# Altium project MVP-Dash-v1.0.PrjPcb (part 5 of 15)

## Sheet RK3568-Flash-SD-Controller.SchDoc
size 420 x 297 mm; SheetNumber: 7; SheetTotal: 25
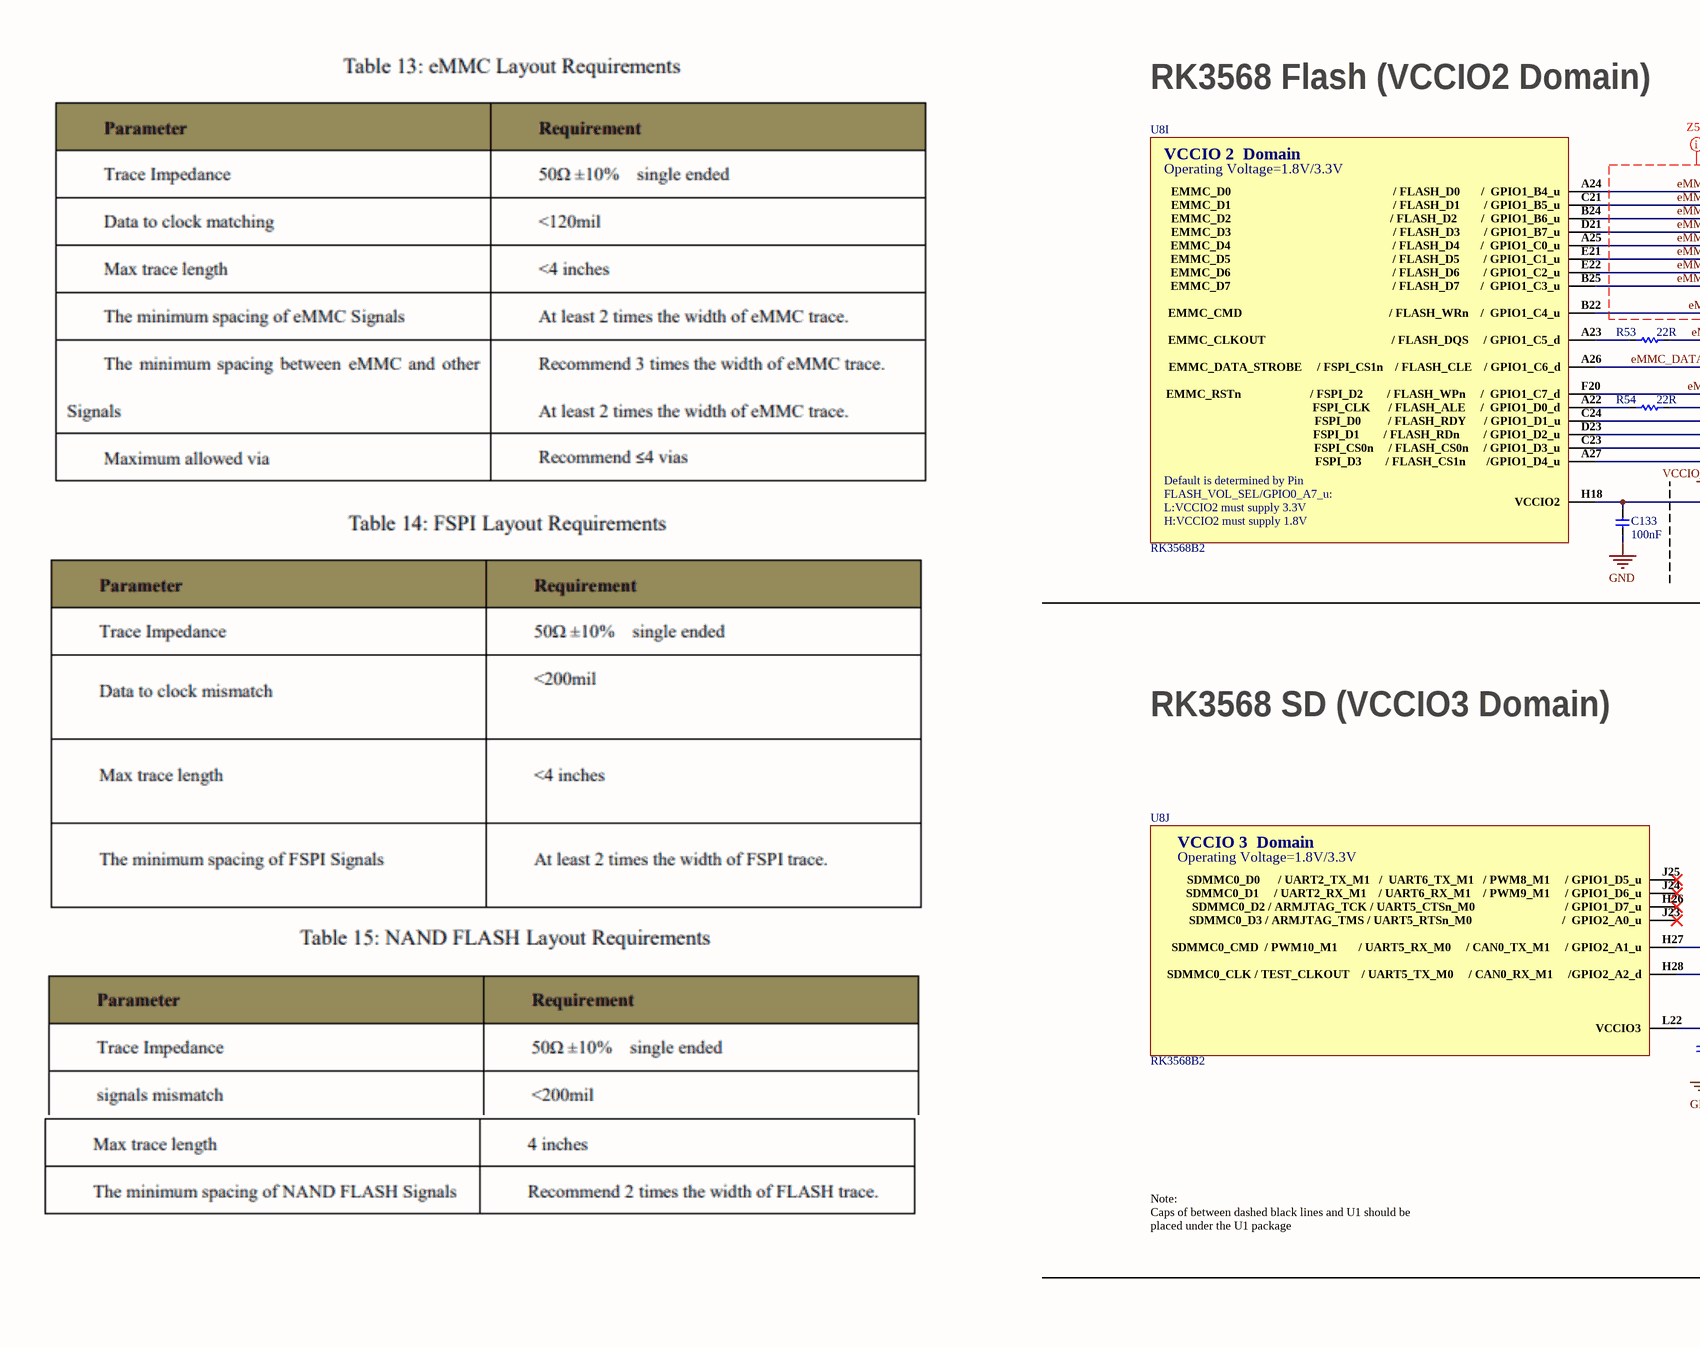
[diagram p8: RK3568-Flash-SD-Controller.SchDoc, left]
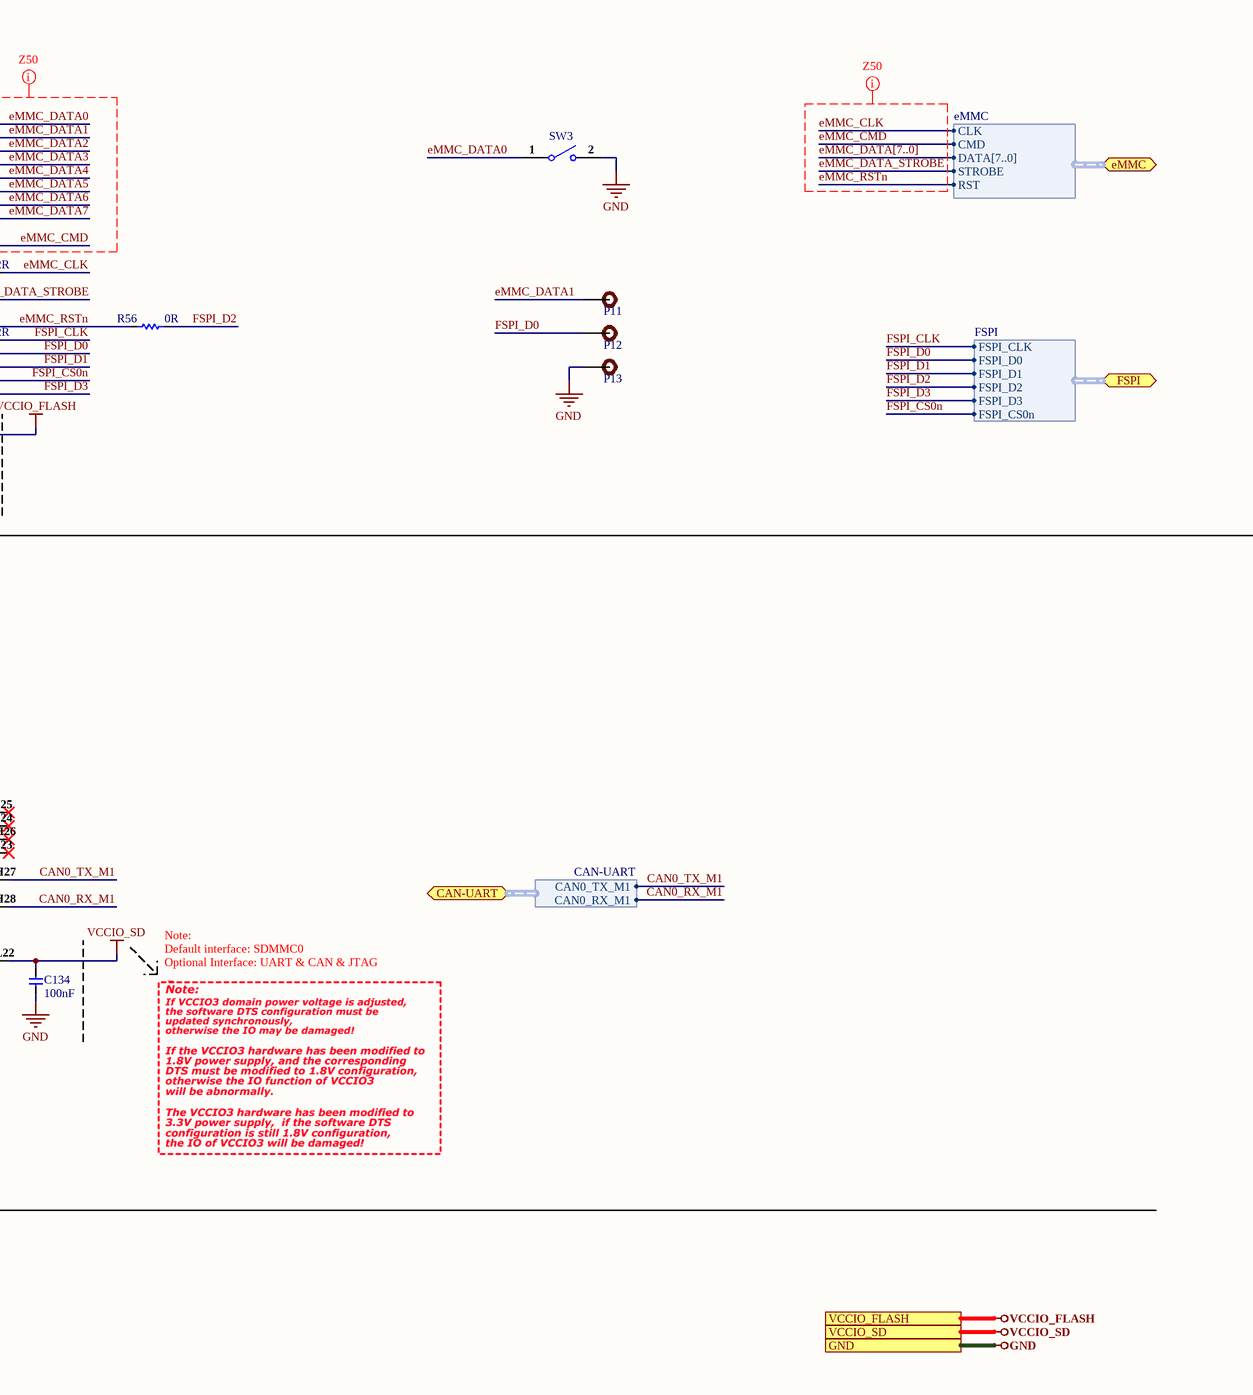
[diagram p9: RK3568-Flash-SD-Controller.SchDoc, right]

### Parts
C133  100nF  [CAP-0201]
C134  100nF  [CAP-0201]
P11  TEST POINT 0.5mm Dia  [Test-point - 0.5mm]  (value not drawn)  (no BOM)
P12  TEST POINT 0.5mm Dia  [Test-point - 0.5mm]  (value not drawn)  (no BOM)
P13  TEST POINT 0.5mm Dia  [Test-point - 0.5mm]  (value not drawn)  (no BOM)
R53  22R  [Res-0402]
R54  22R  [Res-0402]
R56  0R  [Res-0402]
SW3  B3U-1000P  [B3U-1000P]  (value not drawn)
U8  RK3568B2  [FCCSP-636L]  (parts I,J of 23)

### Ports
CAN-UART (bidir, harness CAN-UART, see CAN-Bus-SPI-Flash-Sheet[1D]), eMMC (bidir, harness eMMC, see eMMC-Sheet[2D]), FSPI (bidir, harness FSPI, see CAN-Bus-SPI-Flash-Sheet[3D]), GND (see CAN-Bus-SPI-Flash-Sheet[4D], Connector-Sheet[5D], DRAM-LPDDR4x-Sheet[4D], eMMC-Sheet[4D], LED-Debug-Sheet[4D], Power-DC-IN-Sheet[4D], Power-Others-Sheet[4D], Power-PMIC-Sheet[4D], RK3568-Audio-Interface[4D], RK3568-OSC-PMUIO-Sheet[5D], RK3568-Power-Sheet[4D], RK3568-SARADC-GPIO[4D], RK3568-USB-PCIe-Sheet[5D], RK3568-VI-Interface-Sheet[4D], RK3568-VO-Interface-1[4D], RK3568-VO-Interface-2[4D], Sensors-Sheet-1[4D], Sensors-Sheet-2[5D], Type-C-Sheet[4D], USB-Ports[4D], VO-HDMI2.0-TX-Sheet[4D], VO-LCM-MIPI-DSI-TX0[4D], WIFI-BT-SDIO-Sheet[4D]), VCCIO_FLASH (see CAN-Bus-SPI-Flash-Sheet[4D], eMMC-Sheet[4D], Power-Others-Sheet[4D]), VCCIO_SD (see Power-PMIC-Sheet[3D])

### Harnesses
eMMC: DATA[7..0], STROBE, CLK, CMD, RST
FSPI: FSPI_D2, FSPI_CLK, FSPI_D0, FSPI_D1, FSPI_CS0n, FSPI_D3
CAN-UART: CAN0_TX_M1, CAN0_RX_M1

### Nets
GND: C133.1 C134.1 P13.1 SW3.2 ; port GND
VCCIO_FLASH: C133.2 U8.H18(VCCIO2) ; port VCCIO_FLASH
VCCIO_SD: C134.2 U8.L22(VCCIO3) ; port VCCIO_SD
CAN0_RX_M1: U8.H28(SDMMC0_CLK_/_TEST_CLKOUT____/_UART5_TX_M0_____/_CAN0_RX_M1_____/GPIO2_A2_d) ; port CAN-UART.CAN0_RX_M1
CAN0_TX_M1: U8.H27(SDMMC0_CMD__/_PWM10_M1_______/_UART5_RX_M0_____/_CAN0_TX_M1_____/_GPIO2_A1_u) ; port CAN-UART.CAN0_TX_M1
eMMC_CLK: R53.1 ; port eMMC.CLK
eMMC_CMD: U8.B22(EMMC_CMD_________________________________________________/_FLASH_WRn____/__GPIO1_C4_u) ; port eMMC.CMD
eMMC_DATA0: SW3.1 U8.A24(EMMC_D0______________________________________________________/_FLASH_D0_______/__GPIO1_B4_u)
eMMC_DATA1: P11.1 U8.C21(EMMC_D1______________________________________________________/_FLASH_D1________/_GPIO1_B5_u)
eMMC_DATA2: U8.B24(EMMC_D2_____________________________________________________/_FLASH_D2________/__GPIO1_B6_u)
eMMC_DATA3: U8.D21(EMMC_D3______________________________________________________/_FLASH_D3________/_GPIO1_B7_u)
eMMC_DATA4: U8.A25(EMMC_D4______________________________________________________/_FLASH_D4_______/__GPIO1_C0_u)
eMMC_DATA5: U8.E21(EMMC_D5______________________________________________________/_FLASH_D5________/_GPIO1_C1_u)
eMMC_DATA6: U8.E22(EMMC_D6______________________________________________________/_FLASH_D6________/_GPIO1_C2_u)
eMMC_DATA7: U8.B25(EMMC_D7______________________________________________________/_FLASH_D7_______/__GPIO1_C3_u)
eMMC_DATA_STROBE: U8.A26(EMMC_DATA_STROBE_____/_FSPI_CS1n____/_FLASH_CLE____/_GPIO1_C6_d) ; port eMMC.STROBE
eMMC_RSTn: R56.1 U8.F20(EMMC_RSTn_______________________/_FSPI_D2________/_FLASH_WPn_____/__GPIO1_C7_d) ; port eMMC.RST
FSPI_CLK: R54.1 ; port FSPI.FSPI_CLK
FSPI_CS0n: U8.C23(FSPI_CS0n_____/_FLASH_CS0n_____/_GPIO1_D3_u) ; port FSPI.FSPI_CS0n
FSPI_D0: P12.1 U8.C24(FSPI_D0_________/_FLASH_RDY______/_GPIO1_D1_u) ; port FSPI.FSPI_D0
FSPI_D1: U8.D23(FSPI_D1________/_FLASH_RDn________/_GPIO1_D2_u) ; port FSPI.FSPI_D1
FSPI_D2: R56.2 ; port FSPI.FSPI_D2
FSPI_D3: U8.A27(FSPI_D3________/_FLASH_CS1n_______/GPIO1_D4_u) ; port FSPI.FSPI_D3
NetR53_2: R53.2 U8.A23(EMMC_CLKOUT__________________________________________/_FLASH_DQS_____/_GPIO1_C5_d)
NetR54_2: R54.2 U8.A22(FSPI_CLK______/_FLASH_ALE_____/__GPIO1_D0_d)

Not connected (* = marked no-connect by the designer): U8 H26(SDMMC0_D2_/_ARMJTAG_TCK_/_UART5_CTSn_M0______________________________/_GPIO1_D7_u)* J23(SDMMC0_D3_/_ARMJTAG_TMS_/_UART5_RTSn_M0______________________________/__GPIO2_A0_u)* J24(SDMMC0_D1_____/_UART2_RX_M1____/_UART6_RX_M1____/_PWM9_M1_____/_GPIO1_D6_u)* J25(SDMMC0_D0______/_UART2_TX_M1___/__UART6_TX_M1___/_PWM8_M1_____/_GPIO1_D5_u)*

### Buses and harness runs
bus eMMC_DATA[7..0]

### Layout directives
net class 50OHM_DDR: eMMC_CLK, eMMC_CMD, eMMC_DATA0, eMMC_DATA1, eMMC_DATA2, eMMC_DATA3, eMMC_DATA4, eMMC_DATA5, eMMC_DATA6, eMMC_DATA7, eMMC_DATA[7..0], eMMC_DATA_STROBE, eMMC_RSTn

### Notes on the sheet
- RK3568 Flash (VCCIO2 Domain)
- RK3568 SD (VCCIO3 Domain)
- Note:
  Default interface: SDMMC0
  Optional Interface: UART & CAN & JTAG
- Note:
  Caps of between dashed black lines and U1 should be placed under the U1 package
- File:
- Title:
- Date:
- Page
- Num:
- Total:
- Drawn By: Huzaifa Ali
- (in symbol RK3568B2, part I) VCCIO 2  Domain; Operating Voltage=1.8V/3.3V; Default is determined by Pin; FLASH_VOL_SEL/GPIO0_A7_u:; L:VCCIO2 must supply 3.3V; H:VCCIO2 must supply 1.8V
- (in symbol RK3568B2, part J) VCCIO 3  Domain; Operating Voltage=1.8V/3.3V

### Library data of the parts
C133 C134 = CC0201KRX5R6BB104: as C124-C131 on sheet RK3568-OSC-PMUIO-Sheet; Supplier 1: Mouser; Manufacturer Part Number: CC0201KRX5R6BB104; RoHS: Yes; Category: Ceramic Capacitors; Stock 1: 824403; Pricing 1: 1=0.10000, 10=0.02400, 50=0.02400, 100=0.01900, 1000=0.01100, 10000=0.00900 (USD); Mount: Surface Mount; Case/Package: 0201; Case Code (Imperial): 0201; Case Code (Metric): 0603; Weight: 6E-06oz; Min Operating Temperature: -55°C; Max Operating Temperature: 85°C; Capacitance: 100nF; Dielectric: X5R; Voltage Rating (DC): 10V; Packaging: Tape and Reel; Termination: SMD/SMT; Resistor Type: Ceramic; Voltage Rating: 10V; Series: CC; Construction: Flat; Length: 0.6mm; Width: 0.012inch; Height: 0.3mm; Thickness: 0.013inch; Depth: 0.3mm; Radiation Hardening: No; Lead Free: Lead Free; Halogen Free: Halogen Free; RoHS Compliant: Yes; ComponentLink1URL: https://datasheet.ciiva.com/11587/upy-gphc-x5r-4v-to-50v-12-11587190.pdf?src-supplier=Avnet; ComponentLink1Description: https://datasheet.ciiva.com/11587/upy-gphc-x5r-4v-to-50v-12-11587190.pdf?src-supplier=Avnet; Supplier Part Number 1: 603-CC201KRX5R6BB104; LCSC Part Number: C190183
P11-P13 = TEST POINT 0.5mm Dia: Test Point ON; Item Type: Test Point; Manufacturer Part Number: TEST POINT 0.5mm Dia
R53 R54 = RC0402FR-0722RL: RES 22 OHM 1% 1/16W 0402; Manufacturer: Yageo; Voltage Rating: 50V; Power Rating: 62.5mW; Temperature Coefficient: 100ppm/°C; Max Power Dissipation: 63mW; Item Type: Resistor; Supplier 1: Avnet; Manufacturer Part Number: RC0402FR-0722RL; RoHS: Yes; Category: Chip SMD Resistors; Stock 1: 1810000; Pricing 1: 10000=0.00085 (USD); Case/Package: 0402; Number of Pins: 2; Case Code (Imperial): 0402; Case Code (Metric): 1005; Size Code: 0402; Min Operating Temperature: -55°C; Max Operating Temperature: 155°C; Resistor Type: Thick Film; Voltage Rating (DC): 50V; Resistance: 22R; Tolerance: 1%; Packaging: Tape and Reel; Termination: SMD/SMT; Features: Moisture Resistant; Series: RC; Number of Terminations: 2; Resistance Tolerance: 1%; Technology: THICK FILM; Construction: Rectangular; Length: 1mm; Width: 0.5mm; Height: 0.32mm; Depth: 0.5mm; RoHS Compliant: Yes; Reach SVHC Compliant: Yes; Military Standard: Not; Lead Free: Lead Free; ComponentLink1URL: https://datasheet.ciiva.com/11819/0900766b80c66297-11819462.pdf?src-supplier=RSComponents; ComponentLink1Description: https://datasheet.ciiva.com/11819/0900766b80c66297-11819462.pdf?src-supplier=RSComponents; ComponentLink2URL: https://datasheet.ciiva.com/7849/1018594-7849912.pdf?src-supplier=Element14; ComponentLink2Description: https://datasheet.ciiva.com/7849/1018594-7849912.pdf?src-supplier=Element14; ComponentLink3URL: https://datasheet.ciiva.com/7849/1018594-7849911.pdf?src-supplier=Element14; ComponentLink3Description: https://datasheet.ciiva.com/7849/1018594-7849911.pdf?src-supplier=Element14; ComponentLink4URL: https://datasheet.ciiva.com/16930/pyu-rc0402-51-rohs-l-6-r-16930687.pdf?src-supplier=Future+Electronics; ComponentLink4Description: https://datasheet.ciiva.com/16930/pyu-rc0402-51-rohs-l-6-r-16930687.pdf?src-supplier=Future+Electronics; ComponentLink5URL: https://datasheet.ciiva.com/26829/getdatasheetpartid-554995-26829991.pdf?src-supplier=Verical; ComponentLink5Description: https://datasheet.ciiva.com/26829/getdatasheetpartid-554995-26829991.pdf?src-supplier=Verical; Supplier Part Number 1: RC0402FR-0722RL; LCSC Part Number: C114765
R56 = RC0402FR-070RL: RES 0 OHM JUMPER 1/16W 0402; Manufacturer: Yageo; Tolerance: 1%; Power Rating: 62.5mW; Voltage Rating: 50V; Temperature Coefficient: 200ppm/°C; Max Power Dissipation: 63mW; Supplier 1: Mouser; Manufacturer Part Number: RC0402FR-070RL; RoHS: Yes; Category: Chip SMD Resistors; Stock 1: 8556842; Pricing 1: 1=0.10000, 10=0.01400, 50=0.01400, 100=0.00600, 1000=0.00300, 5000=0.00200, 10000=0.00100 (USD); Mount: Surface Mount; Case/Package: 0402; Contact Plating: Tin,Matte; Case Code (Imperial): 0402; Case Code (Metric): 1005; Size Code: 0402; Min Operating Temperature: -55°C; Max Operating Temperature: 155°C; Resistance: 0R; Resistor Type: Thick Film; Packaging: Tape and Reel; Termination: SMD/SMT; Features: Moisture Resistant; Series: RC; Number of Terminations: 2; Length: 1mm; Width: 0.5mm; Height: 0.35mm; Radiation Hardening: No; Lead Free: Lead Free; RoHS Compliant: Yes; ComponentLink1URL: https://datasheet.ciiva.com/8896/pyu-rc0402-51-rohs-l-6-8896149.pdf?src-supplier=Avnet; ComponentLink1Description: https://datasheet.ciiva.com/8896/pyu-rc0402-51-rohs-l-6-8896149.pdf?src-supplier=Avnet; ComponentLink2URL: https://datasheet.ciiva.com/16790/pyu-rc0402-51-rohs-l-6-r-16790444.pdf?src-supplier=Future+Electronics; ComponentLink2Description: https://datasheet.ciiva.com/16790/pyu-rc0402-51-rohs-l-6-r-16790444.pdf?src-supplier=Future+Electronics; Supplier Part Number 1: 603-RC0402FR-070RL; LCSC Part Number: C106231
SW3 = B3U-1000P: SWITCH TACTILE SPST-NO 0.05A 12V; Manufacturer: Omron; Mechanical Life: 200000Cycles; Operating Force: 1.5N; Throw Configuration: SPST; Current Rating: 50mA; Contact Resistance: 100mR; Illumination Type: Non-Illuminated,Illuminated; Switch Travel: 0.15mm; Switch Function: Off-Mom; Actuator Type: Standard; Actuator Length: 0.4mm; Ratings: Dust Proof,IP40; ComponentLink1URL: http://www.farnell.com/datasheets/60838.pdf?src-supplier=Farnell; ComponentLink1Description: http://www.farnell.com/datasheets/60838.pdf?src-supplier=Farnell; ComponentLink2URL: http://www.farnell.com/datasheets/60838.pdf?src-supplier=Element14; ComponentLink2Description: http://www.farnell.com/datasheets/60838.pdf?src-supplier=Element14; ComponentLink3URL: https://omronfs.omron.com/en_US/ecb/products/pdf/en-b3u.pdf?src-supplier=Digi-Key; ComponentLink3Description: https://omronfs.omron.com/en_US/ecb/products/pdf/en-b3u.pdf?src-supplier=Digi-Key; ComponentLink4URL: http://www.omron.com/ecb/products/pdf/en-b3u.pdf?src-supplier=Digi-Key; ComponentLink4Description: http://www.omron.com/ecb/products/pdf/en-b3u.pdf?src-supplier=Digi-Key; ComponentLink5URL: https://www.distrelec.biz/Web/Downloads/he/et/B3U_eng_datasheet.pdf?mime=application%2Fpdf&src-supplier=Distrelec; ComponentLink5Description: https://www.distrelec.biz/Web/Downloads/he/et/B3U_eng_datasheet.pdf?mime=application%2Fpdf&src-supplier=Distrelec; ComponentLink6URL: http://www.onlinecomponents.com/productFiles/mf-OM/en-b3u.pdf?src-supplier=Onlinecomponents.com; ComponentLink6Description: http://www.onlinecomponents.com/productFiles/mf-OM/en-b3u.pdf?src-supplier=Onlinecomponents.com; Supplier 1: Digi-Key; Manufacturer Part Number: B3U-1000P; Stock 1: 116454; Pricing 1: 1=1, 10=0.961, 25=0.9064, 50=0.7976, 100=0.7251, 250=0.68888, 500=0.67074, 1000=0.52571 (USD); Mount: Surface Mount; Weight: 0.000776oz; Contact Material: Silver; Min Operating Temperature: -25°C; Max Operating Temperature: 70°C; Packaging: Tape and Reel; Voltage Rating (DC): 12V; Package Quantity: 1; Max Current Rating: 50mA; Termination: SMD/SMT; Orientation: Straight; Max Voltage Rating (DC): 12V; Electrical Life: 200000Cycles; Insulation Resistance: 100MR; Contact Current Rating: 50mA; Length: 4mm; Height: 1.2mm; Depth: 2.5mm; Width: 3mm; REACH SVHC: Unknown; Lead Free: Lead Free; ComponentLink7URL: https://www.verical.com/server-webapp/html/getDatasheet?partID=552554&src-supplier=Verical; ComponentLink7Description: https://www.verical.com/server-webapp/html/getDatasheet?partID=552554&src-supplier=Verical; ComponentLink8URL: http://www.farnell.com/datasheets/1685550.pdf?src-supplier=Element14; ComponentLink8Description: http://www.farnell.com/datasheets/1685550.pdf?src-supplier=Element14; ComponentLink9URL: http://www.farnell.com/datasheets/2610940.pdf?src-supplier=Farnell; ComponentLink9Description: http://www.farnell.com/datasheets/2610940.pdf?src-supplier=Farnell; ComponentLink10URL: https://www.alliedelec.com/m/d/4c8a9ef82804fc3c241a13c1e298fd73.pdf?src-supplier=Allied+Electronics; ComponentLink10Description: https://www.alliedelec.com/m/d/4c8a9ef82804fc3c241a13c1e298fd73.pdf?src-supplier=Allied+Electronics; Supplier Part Number 1: SW1020DKR-ND; LCSC Part Number: C231329; Item Type: Switch
U8 = RK3568B2: FCCSP-636L Microcontroller Units (MCUs/MPUs/SOCs) ROHS; Manufacturer: Rockchip; Item Type: IC; Manufacturer Part Number: RK3568B2; Package: FCCSP-636L; LCSC Part Number: C3345225

## Sheet RK3568-USB-PCIe-Sheet.SchDoc
size 420 x 297 mm; SheetNumber: 8; SheetTotal: 25
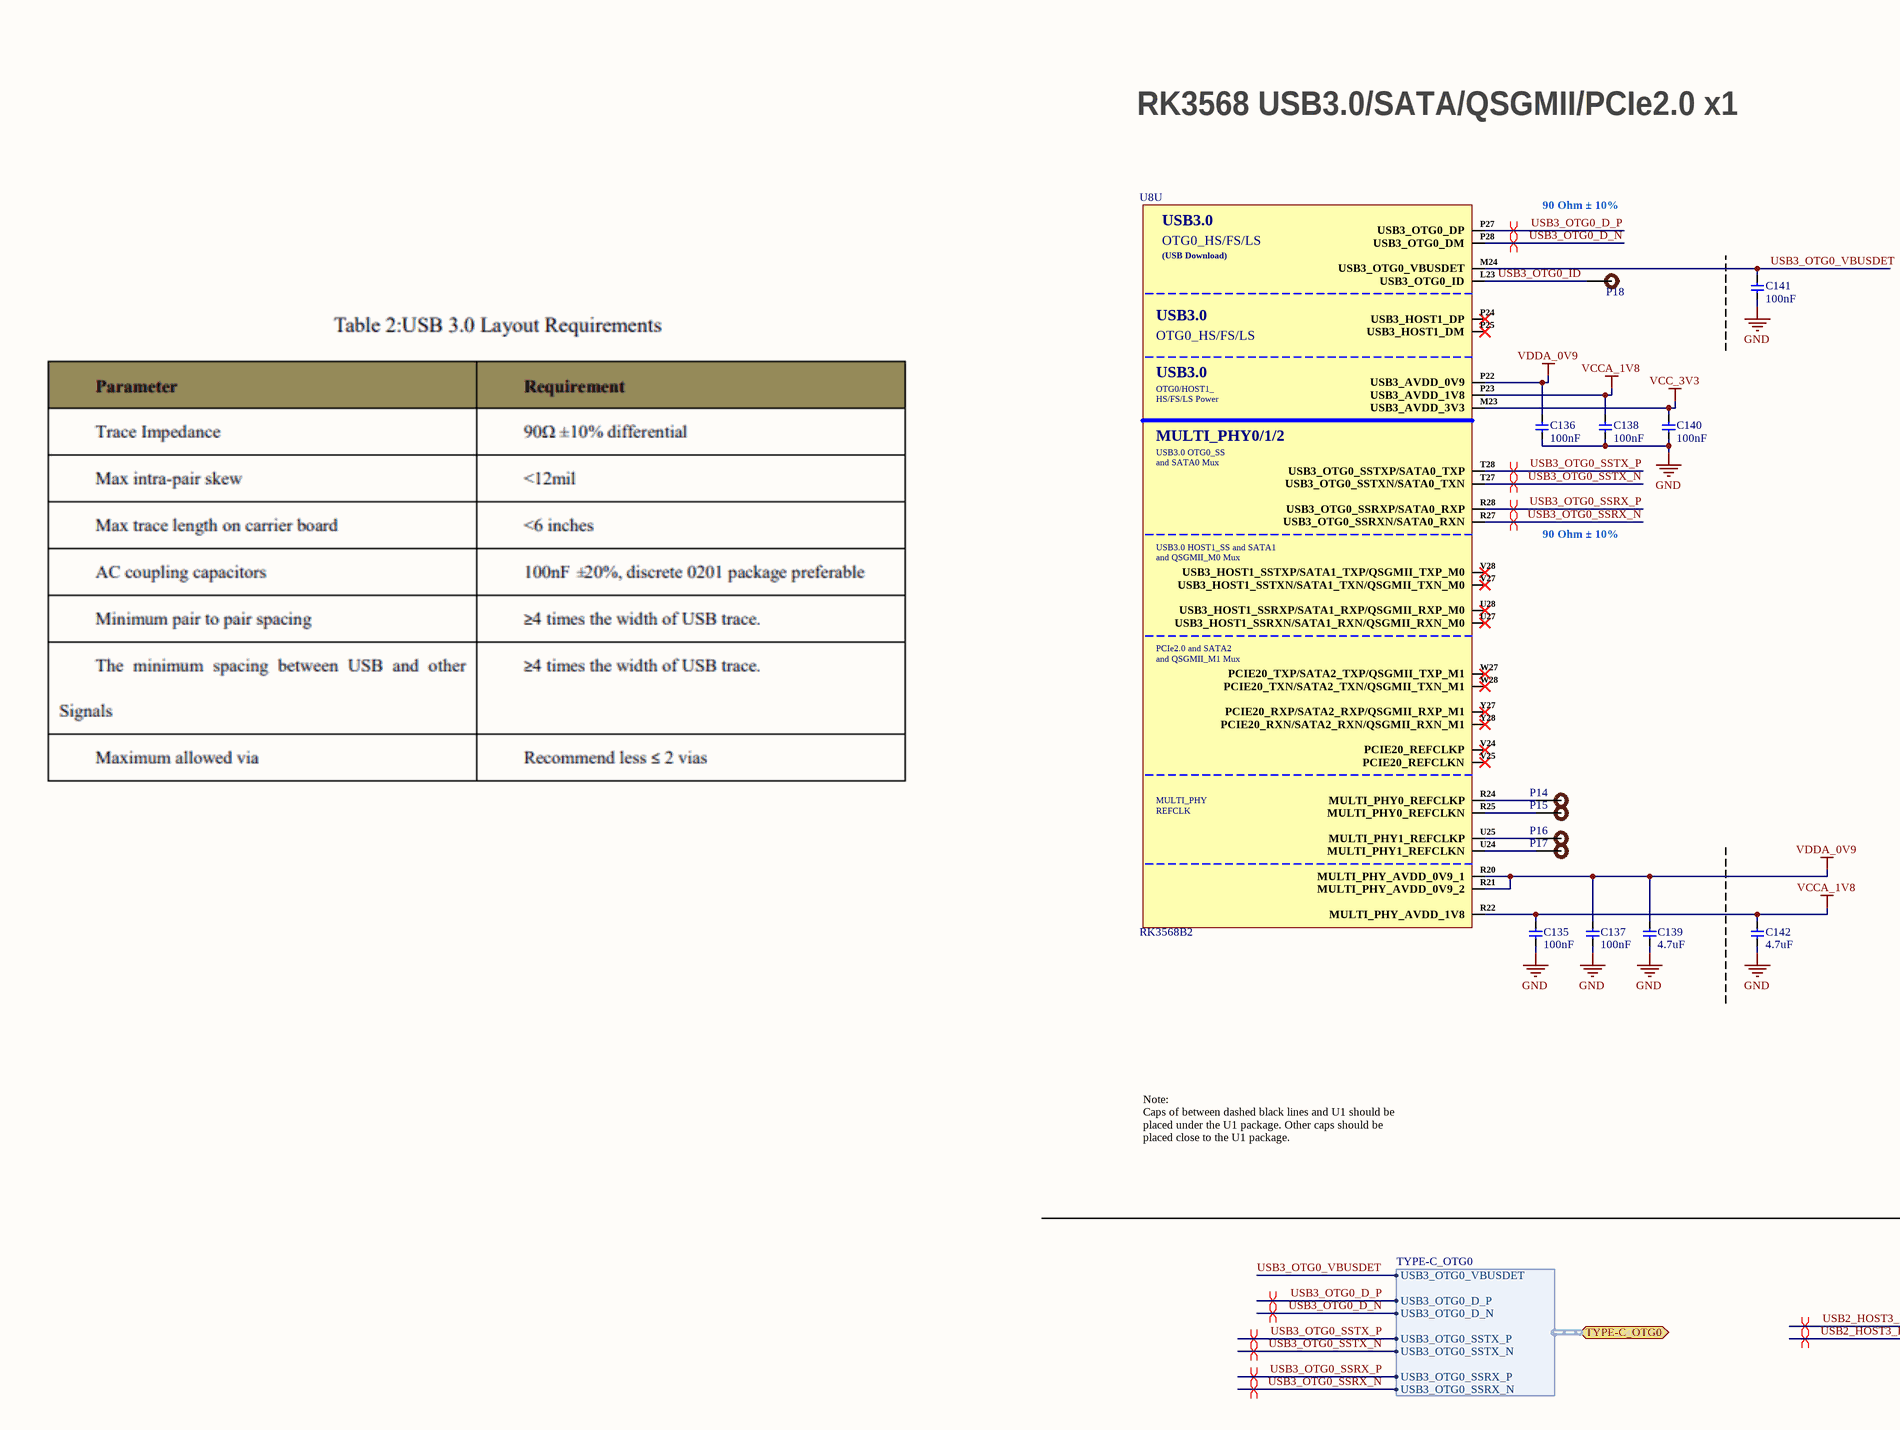
[diagram p10: RK3568-USB-PCIe-Sheet.SchDoc, left]
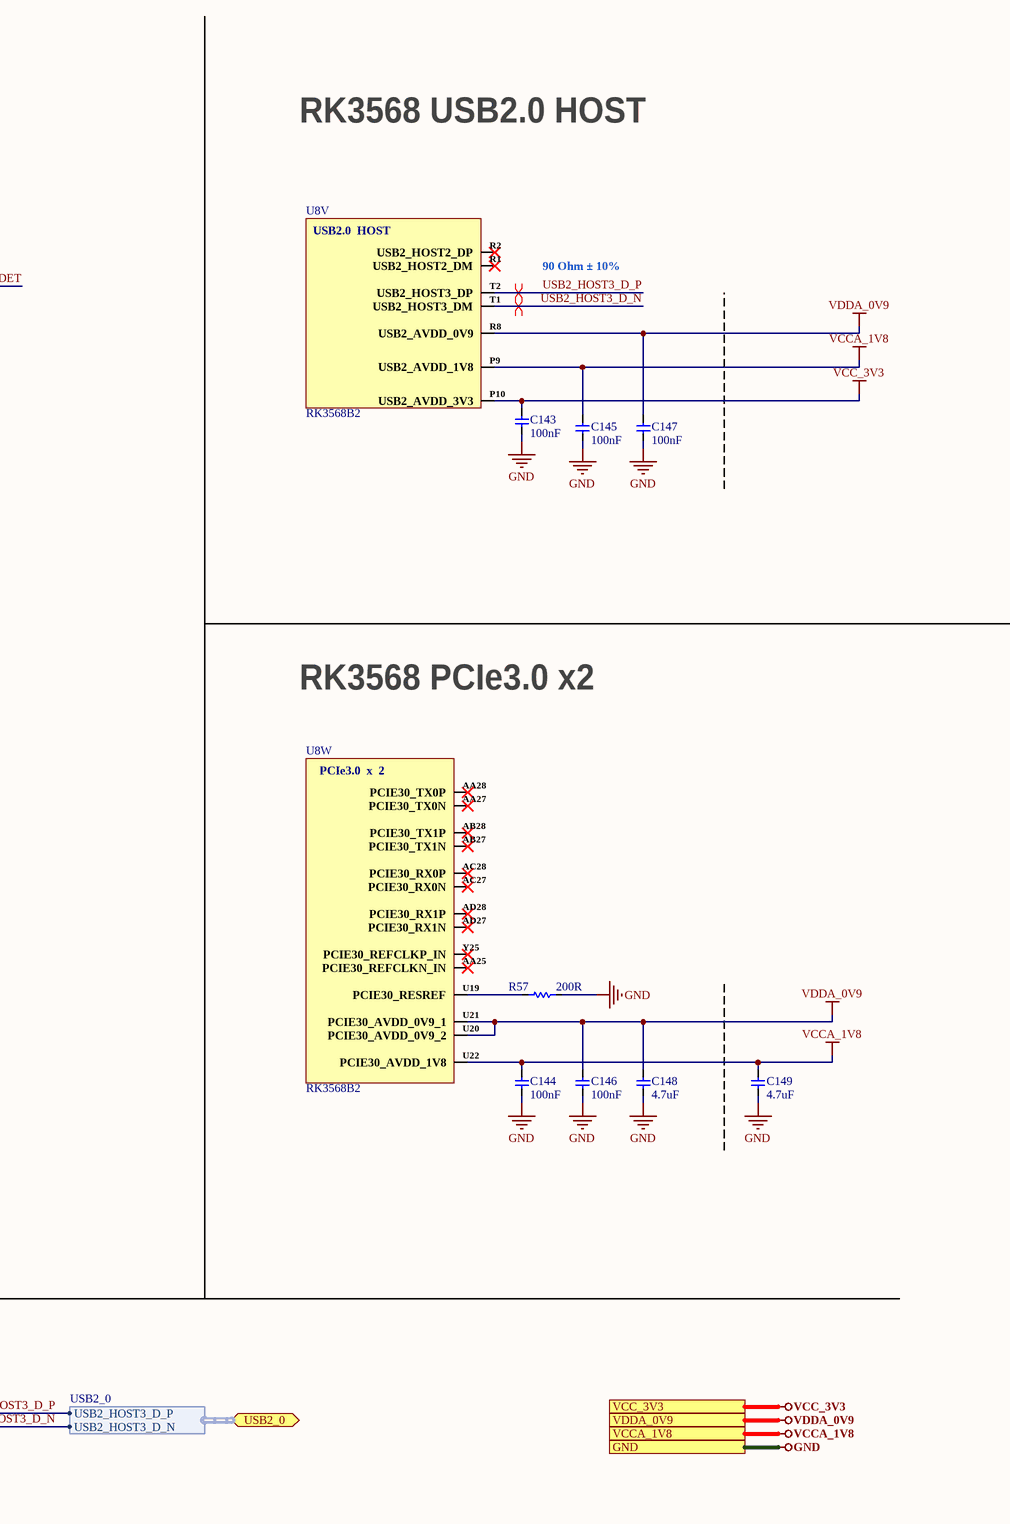
[diagram p11: RK3568-USB-PCIe-Sheet.SchDoc, right]

### Parts
C135  100nF  [CAP-0201]
C136  100nF  [CAP-0201]
C137  100nF  [CAP-0201]
C138  100nF  [CAP-0201]
C139  4.7uF  [Cap-0402]
C140  100nF  [CAP-0201]
C141  100nF  [CAP-0201]
C142  4.7uF  [Cap-0402]
C143  100nF  [CAP-0201]
C144  100nF  [CAP-0201]
C145  100nF  [CAP-0201]
C146  100nF  [CAP-0201]
C147  100nF  [CAP-0201]
C148  4.7uF  [Cap-0402]
C149  4.7uF  [Cap-0402]
P14  TEST POINT 0.5mm Dia  [Test-point - 0.5mm]  (value not drawn)  (no BOM)
P15  TEST POINT 0.5mm Dia  [Test-point - 0.5mm]  (value not drawn)  (no BOM)
P16  TEST POINT 0.5mm Dia  [Test-point - 0.5mm]  (value not drawn)  (no BOM)
P17  TEST POINT 0.5mm Dia  [Test-point - 0.5mm]  (value not drawn)  (no BOM)
P18  TEST POINT 0.5mm Dia  [Test-point - 0.5mm]  (value not drawn)  (no BOM)
R57  200R  [Res-0201]
U8  RK3568B2  [FCCSP-636L]  (parts U,V,W of 23)

### Ports
GND (see Connector-Sheet[5D], DRAM-LPDDR4x-Sheet[4D], eMMC-Sheet[4D], LED-Debug-Sheet[4D], MicroSD-SPI-Flash-Sheet[4D], Power-DC-IN-Sheet[4D], Power-Others-Sheet[4D], Power-PMIC-Sheet[4D], RK3568-Audio-Interface[4D], RK3568-Flash-SD-Controller[4D], RK3568-OSC-PMUIO-Sheet[5D], RK3568-Power-Sheet[4D], RK3568-SARADC-GPIO[4D], RK3568-VI-Interface-Sheet[4D], RK3568-VO-Interface-1[4D], RK3568-VO-Interface-2[4D], Sensors-Sheet-1[4D], Sensors-Sheet-2[5D], Type-C-Sheet[4D], USB-Ports[4D], VO-HDMI2.0-TX-Sheet[4D], VO-LCM-MIPI-DSI-TX0[4D], WIFI-BT-SDIO-Sheet[4D]), TYPE-C_OTG0 (bidir, harness TYPE-C_OTG0, see Type-C-Sheet[2D]), USB2_0 (bidir, harness USB2_0, see USB-Ports[2D]), VCC_3V3 (see eMMC-Sheet[4D], Power-PMIC-Sheet[4D], RK3568-SARADC-GPIO[4D], RK3568-VO-Interface-2[4D], VO-HDMI2.0-TX-Sheet[4D], WIFI-BT-SDIO-Sheet[4D]), VCCA_1V8 (see LED-Debug-Sheet[4D], Power-PMIC-Sheet[4D], RK3568-OSC-PMUIO-Sheet[5D], RK3568-SARADC-GPIO[4D]), VDDA_0V9 (see Power-PMIC-Sheet[3D], RK3568-OSC-PMUIO-Sheet[5D])

### Harnesses
TYPE-C_OTG0: USB3_OTG0_D_P, USB3_OTG0_D_N, USB3_OTG0_VBUSDET, USB3_OTG0_SSTX_P, USB3_OTG0_SSTX_N, USB3_OTG0_SSRX_P, USB3_OTG0_SSRX_N
USB2_0: USB2_HOST3_D_P, USB2_HOST3_D_N

### Nets
GND: C135.1 C136.1 C137.1 C138.1 C139.1 C140.1 C141.1 C142.1 C143.1 C144.1 C145.1 C146.1 C147.1 C148.1 C149.1 R57.2 ; port GND
VCC_3V3: C140.2 C143.2 U8.M23(USB3_AVDD_3V3) U8.P10(USB2_AVDD_3V3) ; port VCC_3V3
VCCA_1V8: C135.2 C138.2 C142.2 C144.2 C145.2 C149.2 U8.P9(USB2_AVDD_1V8) U8.P23(USB3_AVDD_1V8) U8.R22(MULTI_PHY_AVDD_1V8) U8.U22(PCIE30_AVDD_1V8) ; port VCCA_1V8
VDDA_0V9: C136.2 C137.2 C139.2 C146.2 C147.2 C148.2 U8.P22(USB3_AVDD_0V9) U8.R8(USB2_AVDD_0V9) U8.R20(MULTI_PHY_AVDD_0V9_1) U8.R21(MULTI_PHY_AVDD_0V9_2) U8.U20(PCIE30_AVDD_0V9_2) U8.U21(PCIE30_AVDD_0V9_1) ; port VDDA_0V9
USB2_HOST3_D_N: U8.T1(USB2_HOST3_DM) ; port USB2_0.USB2_HOST3_D_N
USB2_HOST3_D_P: U8.T2(USB2_HOST3_DP) ; port USB2_0.USB2_HOST3_D_P
USB3_OTG0_D_N: U8.P28(USB3_OTG0_DM) ; port TYPE-C_OTG0.USB3_OTG0_D_N
USB3_OTG0_D_P: U8.P27(USB3_OTG0_DP) ; port TYPE-C_OTG0.USB3_OTG0_D_P
USB3_OTG0_ID: P18.1 U8.L23(USB3_OTG0_ID)
USB3_OTG0_SSRX_N: U8.R27(USB3_OTG0_SSRXN/SATA0_RXN) ; port TYPE-C_OTG0.USB3_OTG0_SSRX_N
USB3_OTG0_SSRX_P: U8.R28(USB3_OTG0_SSRXP/SATA0_RXP) ; port TYPE-C_OTG0.USB3_OTG0_SSRX_P
USB3_OTG0_SSTX_N: U8.T27(USB3_OTG0_SSTXN/SATA0_TXN) ; port TYPE-C_OTG0.USB3_OTG0_SSTX_N
USB3_OTG0_SSTX_P: U8.T28(USB3_OTG0_SSTXP/SATA0_TXP) ; port TYPE-C_OTG0.USB3_OTG0_SSTX_P
USB3_OTG0_VBUSDET: C141.2 U8.M24(USB3_OTG0_VBUSDET) ; port TYPE-C_OTG0.USB3_OTG0_VBUSDET
NetP14_1: P14.1 U8.R24(MULTI_PHY0_REFCLKP)
NetP15_1: P15.1 U8.R25(MULTI_PHY0_REFCLKN)
NetP16_1: P16.1 U8.U25(MULTI_PHY1_REFCLKP)
NetP17_1: P17.1 U8.U24(MULTI_PHY1_REFCLKN)
NetR57_1: R57.1 U8.U19(PCIE30_RESREF)

Not connected (* = marked no-connect by the designer): U8 AA25(PCIE30_REFCLKN_IN)* AA27(PCIE30_TX0N)* AA28(PCIE30_TX0P)* AB27(PCIE30_TX1N)* AB28(PCIE30_TX1P)* AC27(PCIE30_RX0N)* AC28(PCIE30_RX0P)* AD27(PCIE30_RX1N)* AD28(PCIE30_RX1P)* P24(USB3_HOST1_DP)* P25(USB3_HOST1_DM)* R1(USB2_HOST2_DM)* R2(USB2_HOST2_DP)* U27(USB3_HOST1_SSRXN/SATA1_RXN/QSGMII_RXN_M0)* U28(USB3_HOST1_SSRXP/SATA1_RXP/QSGMII_RXP_M0)* V24(PCIE20_REFCLKP)* V25(PCIE20_REFCLKN)* V27(USB3_HOST1_SSTXN/SATA1_TXN/QSGMII_TXN_M0)* V28(USB3_HOST1_SSTXP/SATA1_TXP/QSGMII_TXP_M0)* W27(PCIE20_TXP/SATA2_TXP/QSGMII_TXP_M1)* W28(PCIE20_TXN/SATA2_TXN/QSGMII_TXN_M1)* Y25(PCIE30_REFCLKP_IN)* Y27(PCIE20_RXP/SATA2_RXP/QSGMII_RXP_M1)* Y28(PCIE20_RXN/SATA2_RXN/QSGMII_RXN_M1)*

### Layout directives
differential pair: USB2_HOST3_D_N, USB2_HOST3_D_P, USB3_OTG0_D_N, USB3_OTG0_D_P, USB3_OTG0_SSRX_N, USB3_OTG0_SSRX_P, USB3_OTG0_SSTX_N, USB3_OTG0_SSTX_P

### Notes on the sheet
- RK3568 USB3.0/SATA/QSGMII/PCIe2.0 x1
- RK3568 USB2.0 HOST
- 90 Ohm ± 10%
- RK3568 PCIe3.0 x2
- Note:
  Caps of between dashed black lines and U1 should be placed under the U1 package. Other caps should be placed close to the U1 package.
- File:
- Title:
- Date:
- Page
- Num:
- Total:
- Drawn By: Huzaifa Ali
- (in symbol RK3568B2, part U) USB3.0; OTG0_HS/FS/LS; (USB Download); OTG0/HOST1_  HS/FS/LS Power; MULTI_PHY0/1/2; USB3.0 OTG0_SS / and SATA0 Mux; USB3.0 HOST1_SS and SATA1 / and QSGMII_M0 Mux; PCIe2.0 and SATA2 / and QSGMII_M1 Mux; MULTI_PHY REFCLK
- (in symbol RK3568B2, part V) USB2.0  HOST
- (in symbol RK3568B2, part W) PCIe3.0  x  2

### Library data of the parts
C135-C138 C140 C141 C143-C147 = CC0201KRX5R6BB104: as C124-C131 on sheet RK3568-OSC-PMUIO-Sheet; Supplier 1: Mouser; Manufacturer Part Number: CC0201KRX5R6BB104; RoHS: Yes; Category: Ceramic Capacitors; Stock 1: 824403; Pricing 1: 1=0.10000, 10=0.02400, 50=0.02400, 100=0.01900, 1000=0.01100, 10000=0.00900 (USD); Mount: Surface Mount; Case/Package: 0201; Case Code (Imperial): 0201; Case Code (Metric): 0603; Weight: 6E-06oz; Min Operating Temperature: -55°C; Max Operating Temperature: 85°C; Capacitance: 100nF; Dielectric: X5R; Voltage Rating (DC): 10V; Packaging: Tape and Reel; Termination: SMD/SMT; Resistor Type: Ceramic; Voltage Rating: 10V; Series: CC; Construction: Flat; Length: 0.6mm; Width: 0.012inch; Height: 0.3mm; Thickness: 0.013inch; Depth: 0.3mm; Radiation Hardening: No; Lead Free: Lead Free; Halogen Free: Halogen Free; RoHS Compliant: Yes; ComponentLink1URL: https://datasheet.ciiva.com/11587/upy-gphc-x5r-4v-to-50v-12-11587190.pdf?src-supplier=Avnet; ComponentLink1Description: https://datasheet.ciiva.com/11587/upy-gphc-x5r-4v-to-50v-12-11587190.pdf?src-supplier=Avnet; Supplier Part Number 1: 603-CC201KRX5R6BB104; LCSC Part Number: C190183
C139 C142 C148 C149 = CC0402KRX5R5BB475: CAP CER 4.7UF 6.3V X5R 0402; Manufacturer: Yageo; Tolerance: 10%; Item Type: Capacitor; Supplier 1: Arrow Electronics; Manufacturer Part Number: CC0402KRX5R5BB475; RoHS: Yes; Category: Ceramic Capacitors; Stock 1: 890000; Pricing 1: 10000=0.02120, 20000=0.02030, 30000=0.02010, 50000=0.01930, 100000=0.01760, 250000=0.01630 (USD); Case/Package: 0402; Voltage Rating (DC): 6.3V; Dielectric: X5R; Capacitance: 4.7uF; Lead Free: Lead Free; Halogen Free: Halogen Free; RoHS Compliant: Yes; ComponentLink1URL: http://www.yageo.com/documents/recent/UPY-GPHC_X5R_4V-to-50V_25.pdf?src-supplier=Digi-Key; ComponentLink1Description: http://www.yageo.com/documents/recent/UPY-GPHC_X5R_4V-to-50V_25.pdf?src-supplier=Digi-Key; ComponentLink2URL: https://www.yageo.com/upload/media/product/productsearch/datasheet/mlcc/UPY-GPHC_X5R_4V-to-50V_26.pdf?src-supplier=Digi-Key; ComponentLink2Description: https://www.yageo.com/upload/media/product/productsearch/datasheet/mlcc/UPY-GPHC_X5R_4V-to-50V_26.pdf?src-supplier=Digi-Key; LCSC Part Number: C541466; Supplier Part Number 1: CC0402KRX5R5BB475
P14-P18 = TEST POINT 0.5mm Dia: Test Point ON; Item Type: Test Point; Manufacturer Part Number: TEST POINT 0.5mm Dia
R57 = RC0201FR-07200RL: RES 200 OHM 1% 1/20W 0201; Manufacturer: Yageo; Voltage Rating: 25V; Power Rating: 50mW; Temperature Coefficient: 200ppm/°C; Item Type: Resistor; Supplier 1: Avnet; Manufacturer Part Number: RC0201FR-07200RL; RoHS: Yes; Category: Chip SMD Resistors; Stock 1: 180000; Pricing 1: 10000=0.00128 (USD); Case/Package: 0201; Case Code (Imperial): 0201; Case Code (Metric): 0603; Size Code: 0201; Min Operating Temperature: -55°C; Max Operating Temperature: 125°C; Package Quantity: 10000; Resistance: 200R; Tolerance: 1%; Packaging: Tape and Reel; Resistor Type: Thick Film; Termination: SMD/SMT; Number of Terminations: 2; Max Power Dissipation: 50mW; Features: Moisture Resistant; Series: RC; Construction: Rectangular; Length: 0.6mm; Width: 0.3mm; Height: 0.01inch; Depth: 0.3mm; Military Standard: Not; Lead Free: Lead Free; RoHS Compliant: Yes; ComponentLink1URL: http://www.mouser.com/ds/2/447/RC0201-559633.pdf?src-supplier=Mouser; ComponentLink1Description: http://www.mouser.com/ds/2/447/RC0201-559633.pdf?src-supplier=Mouser; ComponentLink2URL: http://www.yageo.com/documents/recent/PYu-RC0201_51_RoHS_L_(8).pdf?src-supplier=Future+Electronics; ComponentLink2Description: http://www.yageo.com/documents/recent/PYu-RC0201_51_RoHS_L_(8).pdf?src-supplier=Future+Electronics; ComponentLink3URL: http://www.yageo.com/documents/recent/PYu-RC_Group_51_RoHS_L_10.pdf?src-supplier=Digi-Key; ComponentLink3Description: http://www.yageo.com/documents/recent/PYu-RC_Group_51_RoHS_L_10.pdf?src-supplier=Digi-Key; ComponentLink4URL: http://www.yageo.com/documents/recent/PYu-RC_Group_51_RoHS_L_9.pdf?src-supplier=Digi-Key; ComponentLink4Description: http://www.yageo.com/documents/recent/PYu-RC_Group_51_RoHS_L_9.pdf?src-supplier=Digi-Key; Supplier Part Number 1: RC0201FR-07200RL; LCSC Part Number: C274337
U8 = RK3568B2: as U8 on sheet RK3568-Flash-SD-Controller; Manufacturer Part Number: RK3568B2; Package: FCCSP-636L; LCSC Part Number: C3345225

## Sheet RK3568-SARADC-GPIO.SchDoc
size 420 x 297 mm; SheetNumber: 9; SheetTotal: 25
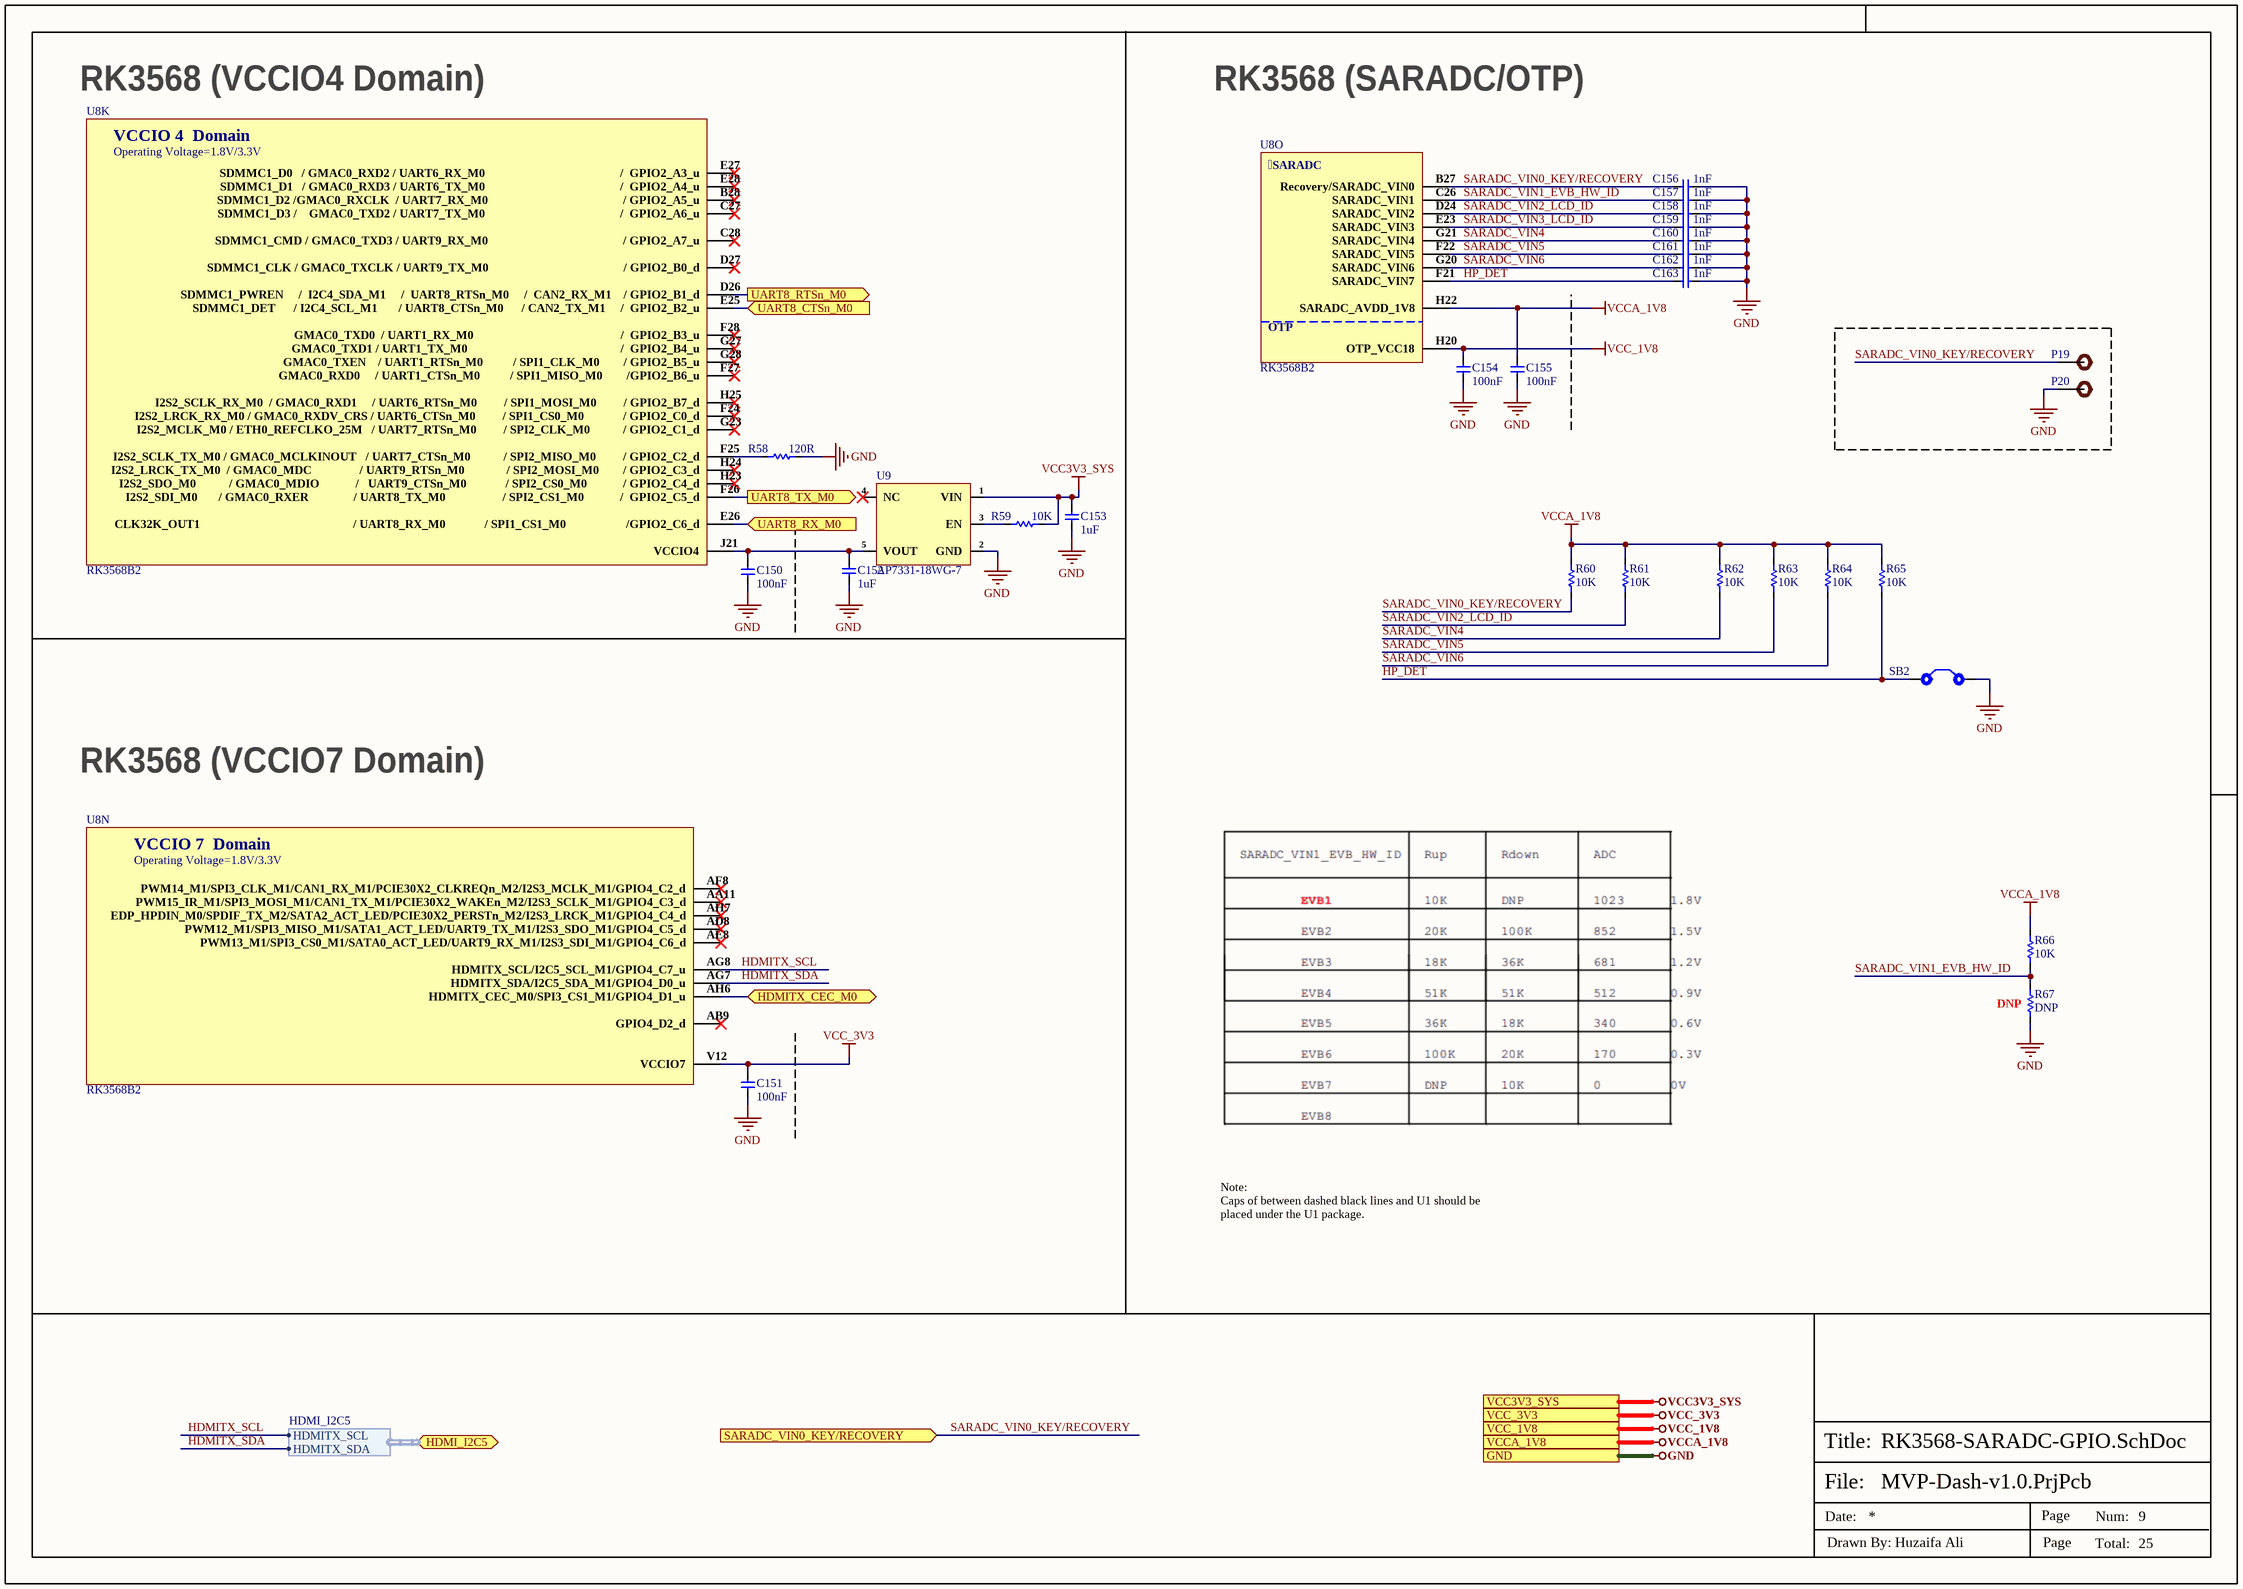
[diagram p12: RK3568-SARADC-GPIO.SchDoc]

### Parts
C150  100nF  [CAP-0201]
C151  100nF  [CAP-0201]
C152  1uF  [Cap-0402]
C153  1uF  [Cap-0402]
C154  100nF  [CAP-0201]
C155  100nF  [CAP-0201]
C156  1nF  [CAP-0201]
C157  1nF  [CAP-0201]
C158  1nF  [CAP-0201]
C159  1nF  [CAP-0201]
C160  1nF  [CAP-0201]
C161  1nF  [CAP-0201]
C162  1nF  [CAP-0201]
C163  1nF  [CAP-0201]
P19  TEST POINT 0.5mm Dia  [Test-point - 0.5mm]  (value not drawn)  (no BOM)
P20  TEST POINT 0.5mm Dia  [Test-point - 0.5mm]  (value not drawn)  (no BOM)
R58  120R  [Res-0201]
R59  10K  [Res-0402]
R60  10K  [Res-0201]
R61  10K  [Res-0201]
R62  10K  [Res-0201]
R63  10K  [Res-0201]
R64  10K  [Res-0201]
R65  10K  [Res-0201]
R66  10K  [Res-0201]
R67  DNP  [Res-0201]
SB2  Solder Bridge 0402  [Solder Bridge 0402]  (value not drawn)  (no BOM)
U8  RK3568B2  [FCCSP-636L]  (parts K,N,O of 23)
U9  AP7331-18WG-7  [SOT-23-5]

### Ports
GND (see CAN-Bus-SPI-Flash-Sheet[4D], Connector-Sheet[5D], DRAM-LPDDR4x-Sheet[4D], eMMC-Sheet[4D], LED-Debug-Sheet[4D], Power-DC-IN-Sheet[4D], Power-Others-Sheet[4D], Power-PMIC-Sheet[4D], RK3568-Audio-Interface[4D], RK3568-Flash-SD-Controller[4D], RK3568-OSC-PMUIO-Sheet[5D], RK3568-Power-Sheet[4D], RK3568-USB-PCIe-Sheet[5D], RK3568-VI-Interface-Sheet[4D], RK3568-VO-Interface-1[4D], RK3568-VO-Interface-2[4D], Sensors-Sheet-1[4D], Sensors-Sheet-2[5D], Type-C-Sheet[4D], USB-Ports[4D], VO-HDMI2.0-TX-Sheet[4D], VO-LCM-MIPI-DSI-TX0[4D], WIFI-BT-SDIO-Sheet[4D]), HDMI_I2C5 (bidir, harness HDMI_I2C5, see VO-HDMI2.0-TX-Sheet[4D]), HDMITX_CEC_M0 (bidir, see VO-HDMI2.0-TX-Sheet[1C]), SARADC_VIN0_KEY/RECOVERY (in, see LED-Debug-Sheet[4A]), UART8_CTSn_M0 (in, see WIFI-BT-SDIO-Sheet[4B]), UART8_RTSn_M0 (out, see WIFI-BT-SDIO-Sheet[4B]), UART8_RX_M0 (in, see WIFI-BT-SDIO-Sheet[4B]), UART8_TX_M0 (out, see WIFI-BT-SDIO-Sheet[4B]), VCC3V3_SYS (see DRAM-LPDDR4x-Sheet[4D], Power-DC-IN-Sheet[4D], Power-PMIC-Sheet[3D]), VCC_1V8 (see Power-Others-Sheet[4D], Power-PMIC-Sheet[4D], RK3568-VI-Interface-Sheet[4D], WIFI-BT-SDIO-Sheet[4D]), VCC_3V3 (see eMMC-Sheet[4D], Power-PMIC-Sheet[4D], RK3568-USB-PCIe-Sheet[5D], RK3568-VO-Interface-2[4D], VO-HDMI2.0-TX-Sheet[4D], WIFI-BT-SDIO-Sheet[4D]), VCCA_1V8 (see LED-Debug-Sheet[4D], Power-PMIC-Sheet[4D], RK3568-OSC-PMUIO-Sheet[5D], RK3568-USB-PCIe-Sheet[5D])

### Harnesses
HDMI_I2C5: HDMITX_SCL, HDMITX_SDA

### Nets
GND: C150.1 C151.1 C152.2 C153.2 C154.1 C155.1 C156.2 C157.2 C158.2 C159.2 C160.2 C161.2 C162.2 C163.2 P20.1 R58.2 R67.2 SB2.2 U9.2(GND) ; port GND
VCC3V3_SYS: C153.1 R59.1 U9.1(VIN) ; port VCC3V3_SYS
VCC_1V8: C154.2 U8.H20(OTP_VCC18) ; port VCC_1V8
VCC_3V3: C151.2 U8.V12(VCCIO7) ; port VCC_3V3
VCCA_1V8: C155.2 R60.1 R61.1 R62.1 R63.1 R64.1 R65.1 R66.1 U8.H22(SARADC_AVDD_1V8) ; port VCCA_1V8
HDMITX_SCL: U8.AG8(HDMITX_SCL/I2C5_SCL_M1/GPIO4_C7_u) ; port HDMI_I2C5.HDMITX_SCL
HDMITX_SDA: U8.AG7(HDMITX_SDA/I2C5_SDA_M1/GPIO4_D0_u) ; port HDMI_I2C5.HDMITX_SDA
HP_DET: C163.1 R65.2 SB2.1 U8.F21(SARADC_VIN7)
SARADC_VIN0_KEY/RECOVERY: C156.1 P19.1 R60.2 U8.B27(Recovery/SARADC_VIN0) ; port SARADC_VIN0_KEY/RECOVERY
SARADC_VIN1_EVB_HW_ID: C157.1 R66.2 R67.1 U8.C26(SARADC_VIN1)
SARADC_VIN2_LCD_ID: C158.1 R61.2 U8.D24(SARADC_VIN2)
SARADC_VIN3_LCD_ID: C159.1 U8.E23(SARADC_VIN3)
SARADC_VIN4: C160.1 R62.2 U8.G21(SARADC_VIN4)
SARADC_VIN5: C161.1 R63.2 U8.F22(SARADC_VIN5)
SARADC_VIN6: C162.1 R64.2 U8.G20(SARADC_VIN6)
NetC150_2: C150.2 C152.1 U8.J21(VCCIO4) U9.5(VOUT)
NetQ5_2: U8.AH6(HDMITX_CEC_M0/SPI3_CS1_M1/GPIO4_D1_u) ; port HDMITX_CEC_M0
NetR58_1: R58.1 U8.F25(I2S2_SCLK_TX_M0_/_GMAC0_MCLKINOUT___/_UART7_CTSn_M0___________/_SPI2_MISO_M0_________/_GPIO2_C2_d)
NetR59_2: R59.2 U9.3(EN)
NetR161_2: U8.D26(SDMMC1_PWREN_____/__I2C4_SDA_M1_____/__UART8_RTSn_M0_____/__CAN2_RX_M1____/_GPIO2_B1_d) ; port UART8_RTSn_M0
NetR162_2: U8.E25(SDMMC1_DET______/_I2C4_SCL_M1_______/_UART8_CTSn_M0______/_CAN2_TX_M1_____/__GPIO2_B2_u) ; port UART8_CTSn_M0
NetU8_E26: U8.E26(CLK32K_OUT1___________________________________________________/_UART8_RX_M0_____________/_SPI1_CS1_M0____________________/GPIO2_C6_d) ; port UART8_RX_M0
NetU8_F26: U8.F26(I2S2_SDI_M0_______/_GMAC0_RXER_______________/_UART8_TX_M0___________________/_SPI2_CS1_M0____________/__GPIO2_C5_d) ; port UART8_TX_M0

Not connected (* = marked no-connect by the designer): U8 AA11(PWM15_IR_M1/SPI3_MOSI_M1/CAN1_TX_M1/PCIE30X2_WAKEn_M2/I2S3_SCLK_M1/GPIO4_C3_d)* AB9(GPIO4_D2_d)* AD8(PWM12_M1/SPI3_MISO_M1/SATA1_ACT_LED/UART9_TX_M1/I2S3_SDO_M1/GPIO4_C5_d)* AE8(PWM13_M1/SPI3_CS0_M1/SATA0_ACT_LED/UART9_RX_M1/I2S3_SDI_M1/GPIO4_C6_d)* AF8(PWM14_M1/SPI3_CLK_M1/CAN1_RX_M1/PCIE30X2_CLKREQn_M2/I2S3_MCLK_M1/GPIO4_C2_d)* AH7(EDP_HPDIN_M0/SPDIF_TX_M2/SATA2_ACT_LED/PCIE30X2_PERSTn_M2/I2S3_LRCK_M1/GPIO4_C4_d)* B28(SDMMC1_D2_/GMAC0_RXCLK__/_UART7_RX_M0_____________________________________________/_GPIO2_A5_u)* C27(SDMMC1_D3_/____GMAC0_TXD2_/_UART7_TX_M0_____________________________________________/__GPIO2_A6_u)* C28(SDMMC1_CMD_/_GMAC0_TXD3_/_UART9_RX_M0_____________________________________________/_GPIO2_A7_u)* D27(SDMMC1_CLK_/_GMAC0_TXCLK_/_UART9_TX_M0_____________________________________________/_GPIO2_B0_d)* E27(SDMMC1_D0___/_GMAC0_RXD2_/_UART6_RX_M0_____________________________________________/__GPIO2_A3_u)* E28(SDMMC1_D1___/_GMAC0_RXD3_/_UART6_TX_M0_____________________________________________/__GPIO2_A4_u)* F24(I2S2_LRCK_RX_M0_/_GMAC0_RXDV_CRS_/_UART6_CTSn_M0_________/_SPI1_CS0_M0_____________/_GPIO2_C0_d)* F27(GMAC0_RXD0_____/_UART1_CTSn_M0__________/_SPI1_MISO_M0________/GPIO2_B6_u)* F28(GMAC0_TXD0__/_UART1_RX_M0_________________________________________________/__GPIO2_B3_u)* G23(I2S2_MCLK_M0_/_ETH0_REFCLKO_25M___/_UART7_RTSn_M0_________/_SPI2_CLK_M0___________/_GPIO2_C1_d)* G27(GMAC0_TXD1_/_UART1_TX_M0___________________________________________________/__GPIO2_B4_u)* G28(GMAC0_TXEN____/_UART1_RTSn_M0__________/_SPI1_CLK_M0________/_GPIO2_B5_u)* H23(I2S2_SDO_M0___________/_GMAC0_MDIO____________/___UART9_CTSn_M0_____________/_SPI2_CS0_M0____________/_GPIO2_C4_d)* H24(I2S2_LRCK_TX_M0__/_GMAC0_MDC________________/_UART9_RTSn_M0______________/_SPI2_MOSI_M0________/_GPIO2_C3_d)* H25(I2S2_SCLK_RX_M0__/_GMAC0_RXD1_____/_UART6_RTSn_M0_________/_SPI1_MOSI_M0_________/_GPIO2_B7_d)*; U9 4(NC)*

### Notes on the sheet
- RK3568 (VCCIO4 Domain)
- RK3568 (SARADC/OTP)
- RK3568 (VCCIO7 Domain)
- (near R67) DNP
- Note:
  Caps of between dashed black lines and U1 should be placed under the U1 package.
- File:
- Title:
- Date:
- Page
- Num:
- Total:
- Drawn By: Huzaifa Ali
- (in symbol RK3568B2, part K) VCCIO 4  Domain; Operating Voltage=1.8V/3.3V
- (in symbol RK3568B2, part N) VCCIO 7  Domain; Operating Voltage=1.8V/3.3V
- (in symbol RK3568B2, part O) SARADC; OTP

### Library data of the parts
C150 C151 C154 C155 = CC0201KRX5R6BB104: as C124-C131 on sheet RK3568-OSC-PMUIO-Sheet; Supplier 1: Mouser; Manufacturer Part Number: CC0201KRX5R6BB104; RoHS: Yes; Category: Ceramic Capacitors; Stock 1: 824403; Pricing 1: 1=0.10000, 10=0.02400, 50=0.02400, 100=0.01900, 1000=0.01100, 10000=0.00900 (USD); Mount: Surface Mount; Case/Package: 0201; Case Code (Imperial): 0201; Case Code (Metric): 0603; Weight: 6E-06oz; Min Operating Temperature: -55°C; Max Operating Temperature: 85°C; Capacitance: 100nF; Dielectric: X5R; Voltage Rating (DC): 10V; Packaging: Tape and Reel; Termination: SMD/SMT; Resistor Type: Ceramic; Voltage Rating: 10V; Series: CC; Construction: Flat; Length: 0.6mm; Width: 0.012inch; Height: 0.3mm; Thickness: 0.013inch; Depth: 0.3mm; Radiation Hardening: No; Lead Free: Lead Free; Halogen Free: Halogen Free; RoHS Compliant: Yes; ComponentLink1URL: https://datasheet.ciiva.com/11587/upy-gphc-x5r-4v-to-50v-12-11587190.pdf?src-supplier=Avnet; ComponentLink1Description: https://datasheet.ciiva.com/11587/upy-gphc-x5r-4v-to-50v-12-11587190.pdf?src-supplier=Avnet; Supplier Part Number 1: 603-CC201KRX5R6BB104; LCSC Part Number: C190183
C152 C153 = CC0402KRX5R6BB105: as C119-C122 on sheet RK3568-OSC-PMUIO-Sheet; Supplier 1: Mouser; Manufacturer Part Number: CC0402KRX5R6BB105; RoHS: Yes; Category: Ceramic Capacitors; Stock 1: 6711367; Pricing 1: 1=0.11000, 10=0.05500, 50=0.05500, 100=0.03300, 500=0.02700, 1000=0.02200, 2500=0.02100, 10000=0.01800 (USD); Mount: Surface Mount; Case/Package: 0402; Number of Pins: 2; Case Code (Metric): 1005; Case Code (Imperial): 0402; Min Operating Temperature: -55°C; Max Operating Temperature: 85°C; Capacitance: 1uF; Dielectric: X5R; Package Quantity: 1; Voltage Rating: 10V; Packaging: Tape and Reel; Voltage Rating (DC): 10V; Termination: SMD/SMT; Resistor Type: Ceramic; Series: CC; Construction: Flat; Length: 1mm; Width: 0.02inch; Height: 0.5mm; Thickness: 0.022inch; Depth: 0.5mm; Radiation Hardening: No; REACH SVHC: No SVHC; Lead Free: Lead Free; Halogen Free: Halogen Free; RoHS Compliant: Yes; ComponentLink1URL: https://datasheet.ciiva.com/176/upy-gphc-x5r-4v-to-50v-12-176704.pdf?src-supplier=Digi-Key; ComponentLink1Description: https://datasheet.ciiva.com/176/upy-gphc-x5r-4v-to-50v-12-176704.pdf?src-supplier=Digi-Key; ComponentLink2URL: https://datasheet.ciiva.com/176/mlccorderingcode-176705.pdf?src-supplier=Digi-Key; ComponentLink2Description: https://datasheet.ciiva.com/176/mlccorderingcode-176705.pdf?src-supplier=Digi-Key; ComponentLink3URL: https://datasheet.ciiva.com/176/mlccorderingcode-176706.pdf?src-supplier=Digi-Key; ComponentLink3Description: https://datasheet.ciiva.com/176/mlccorderingcode-176706.pdf?src-supplier=Digi-Key; Supplier Part Number 1: 603-CC402KRX5R6BB105; LCSC Part Number: C106254
C156-C163 = 0201B102K500NT: 50V 1nF X7R ±10% 0201 Multilayer Ceramic Capacitors MLCC - SMD/SMT ROHS; Manufacturer: FH; Manufacturer Part Number: 0201B102K500NT; ComponentLink1URL: https://www.lcsc.com/product-detail/Multilayer-Ceramic-Capacitors-MLCC-SMD-SMT_FH-Guangdong-Fenghua-Advanced-Tech-0201B102K500NT_C66942.html; ComponentLink1Description: LCSC; LCSC Part Number: C66942; Item Type: Capacitor; Value: 1nF
P19 P20 = TEST POINT 0.5mm Dia: Test Point ON; Item Type: Test Point; Manufacturer Part Number: TEST POINT 0.5mm Dia
R58 = RC0201FR-07120RL: RES 120 OHM 1% 1/20W 0201; Manufacturer: Yageo; Item Type: Resistor; Supplier: Digikey; Supplier Part Number: 311-120MCT-ND; Manufacturer Part Number: RC0201FR-07120RL; RoHS: Yes; Category: Chip SMD Resistors; Stock: 38339; Pricing: 1=0.1, 10=0.027, 50=0.0172, 100=0.0143, 500=0.00988, 1000=0.00854, 5000=0.00629 (USD); Lead Free: 5697LeadFree; ComponentLink1URL: https://datasheet.ciiva.com/2525/pyu-r-int-thick-7-2525064.pdf?src-supplier=Digikey; ComponentLink1Description: https://datasheet.ciiva.com/2525/pyu-r-int-thick-7-2525064.pdf?src-supplier=Digikey; ComponentLink2URL: https://datasheet.ciiva.com/22661/1563626-22661285.pdf?src-supplier=Element14; ComponentLink2Description: https://datasheet.ciiva.com/22661/1563626-22661285.pdf?src-supplier=Element14; ComponentLink3URL: https://datasheet.ciiva.com/2525/pyu-r-int-thick-7-2525062.pdf?src-supplier=Digikey; ComponentLink3Description: https://datasheet.ciiva.com/2525/pyu-r-int-thick-7-2525062.pdf?src-supplier=Digikey; ComponentLink4URL: https://datasheet.ciiva.com/2525/pyu-r-int-thick-7-2525063.pdf?src-supplier=Digikey; ComponentLink4Description: https://datasheet.ciiva.com/2525/pyu-r-int-thick-7-2525063.pdf?src-supplier=Digikey; LCSC Part Number: C295718
R59 = RC0402FR-0710KL: RES 10K OHM 1% 1/16W 0402; Manufacturer: Yageo; Resistance: 10kR; Voltage Rating (DC): 50V; Temperature Coefficient: 100ppm/°C; Power Rating: 62.5mW; Max Power Dissipation: 63mW; Item Type: Resistor; Supplier 1: Mouser; Manufacturer Part Number: RC0402FR-0710KL; RoHS: Yes; Category: Chip SMD Resistors; Stock 1: 18648329; Pricing 1: 1=0.10000, 10=0.01400, 50=0.01400, 100=0.00500, 1000=0.00300, 10000=0.00200 (USD); Case/Package: 0402; Number of Pins: 2; Case Code (Imperial): 0402; Case Code (Metric): 1005; Min Operating Temperature: -55°C; Max Operating Temperature: 155°C; Resistor Type: Thick Film; Tolerance: 1%; Packaging: Tape and Reel; Voltage Rating: 50V; Termination: SMD/SMT; Working Voltage: 50V; Number of Terminations: 2; Features: Moisture Resistant; Series: RC; Resistance Tolerance: 1%; Construction: Rectangular; Length: 1mm; Width: 0.5mm; Height: 0.32mm; Depth: 0.5mm; Lead Pitch: 0.2mm; REACH SVHC: No SVHC; Lead Free: Lead Free; RoHS Compliant: Yes; Military Standard: Not; ComponentLink1URL: https://datasheet.ciiva.com/7660/38568-7660787.pdf?src-supplier=Element14; ComponentLink1Description: https://datasheet.ciiva.com/7660/38568-7660787.pdf?src-supplier=Element14; ComponentLink2URL: https://datasheet.ciiva.com/7849/1686128-7849814.pdf?src-supplier=Element14; ComponentLink2Description: https://datasheet.ciiva.com/7849/1686128-7849814.pdf?src-supplier=Element14; ComponentLink3URL: https://datasheet.ciiva.com/7983/1018594-7983486.pdf?src-supplier=Element14; ComponentLink3Description: https://datasheet.ciiva.com/7983/1018594-7983486.pdf?src-supplier=Element14; ComponentLink4URL: https://datasheet.ciiva.com/22747/1018594-22747512.pdf?src-supplier=Element14; ComponentLink4Description: https://datasheet.ciiva.com/22747/1018594-22747512.pdf?src-supplier=Element14; ComponentLink5URL: https://datasheet.ciiva.com/12667/pyu-rc0402-51-rohs-l-6-r-12667067.pdf?src-supplier=Mouser; ComponentLink5Description: https://datasheet.ciiva.com/12667/pyu-rc0402-51-rohs-l-6-r-12667067.pdf?src-supplier=Mouser; ComponentLink6URL: https://datasheet.ciiva.com/7849/1784430-7849813.pdf?src-supplier=Element14; ComponentLink6Description: https://datasheet.ciiva.com/7849/1784430-7849813.pdf?src-supplier=Element14; ComponentLink7URL: https://datasheet.ciiva.com/7849/1784430-7849815.pdf?src-supplier=Element14; ComponentLink7Description: https://datasheet.ciiva.com/7849/1784430-7849815.pdf?src-supplier=Element14; Supplier Part Number 1: 603-RC0402FR-0710KL; LCSC Part Number: C60490
R60-R67 = RC0201FR-0710KL: RES SMD 10K OHM 1% 1/20W 0201; Manufacturer: Yageo; Item Type: Resistor; Manufacturer Part Number: RC0201FR-0710KL; ComponentLink7URL: https://www.lcsc.com/product-detail/Chip-Resistor-Surface-Mount_YAGEO-RC0201FR-0710KL_C106225.html; ComponentLink7Description: LCSC; LCSC Part Number: C106225; Package: 0201
SB2 = Solder Bridge 0402: Solder Bridge ON; Manufacturer Part Number: Solder Bridge 0402; Item Type: Solder Bridge
U8 = RK3568B2: as U8 on sheet RK3568-Flash-SD-Controller; Manufacturer Part Number: RK3568B2; Package: FCCSP-636L; LCSC Part Number: C3345225
U9 = AP7331-18WG-7: IC REG LINEAR 1.8V 300MA SOT25; Manufacturer: Diodes; Number of Outputs: 1; Min Input Voltage: 2V; Max Input Voltage: 6V; Max Power Dissipation: 640mW; Polarity: Positive; Quiescent Current: 55uA; Accuracy: 2%; Output Type: Fixed; Dropout Voltage: 550mV; Min Current Limit: 400mA; Reference Voltage: 400mV; Power Dissipation: 640W; Power Supply Rejection Ratio (PSRR): 65dB; Supplier 1: Digi-Key; Manufacturer Part Number: AP7331-18WG-7; RoHS: Yes; Category: Voltage Regulators - Linear; Stock 1: 2879; Pricing 1: 1=0.48000, 10=0.38700, 25=0.35400, 100=0.26360, 250=0.23884, 500=0.19766, 1000=0.14825 (USD); Mount: Surface Mount; Case/Package: SOT-25; Number of Pins: 5; Contact Plating: Tin,Matte; Min Operating Temperature: -40°C; Max Operating Temperature: 85°C; Max Output Current: 300mA; Output Voltage: 1.8V; Packaging: Tape and Reel; Output Current: 300mA; Package Quantity: 3000; Number of Regulators: 1; Series: AP7331; Length: 3.1mm; Width: 1.7mm; Height: 1.3mm; Radiation Hardening: No; Lead Free: Lead Free; REACH SVHC: No SVHC; RoHS Compliant: Yes; ComponentLink1URL: https://datasheet.ciiva.com/4887/ap7331-84206-4887904.pdf?src-supplier=Mouser; ComponentLink1Description: https://datasheet.ciiva.com/4887/ap7331-84206-4887904.pdf?src-supplier=Mouser; ComponentLink2URL: https://datasheet.ciiva.com/26856/getdatasheetpartid-661842-26856377.pdf?src-supplier=Verical; ComponentLink2Description: https://datasheet.ciiva.com/26856/getdatasheetpartid-661842-26856377.pdf?src-supplier=Verical; ComponentLink3URL: https://datasheet.ciiva.com/26908/ap7331-18wg-7-26908418.pdf?src-supplier=IIIC; ComponentLink3Description: https://datasheet.ciiva.com/26908/ap7331-18wg-7-26908418.pdf?src-supplier=IIIC; Supplier Part Number 1: AP7331-18WG-7DICT-ND; LCSC Part Number: C155293; Item Type: IC

## Sheet RK3568-VI-Interface-Sheet.SchDoc
size 420 x 297 mm; SheetNumber: 10; SheetTotal: 25
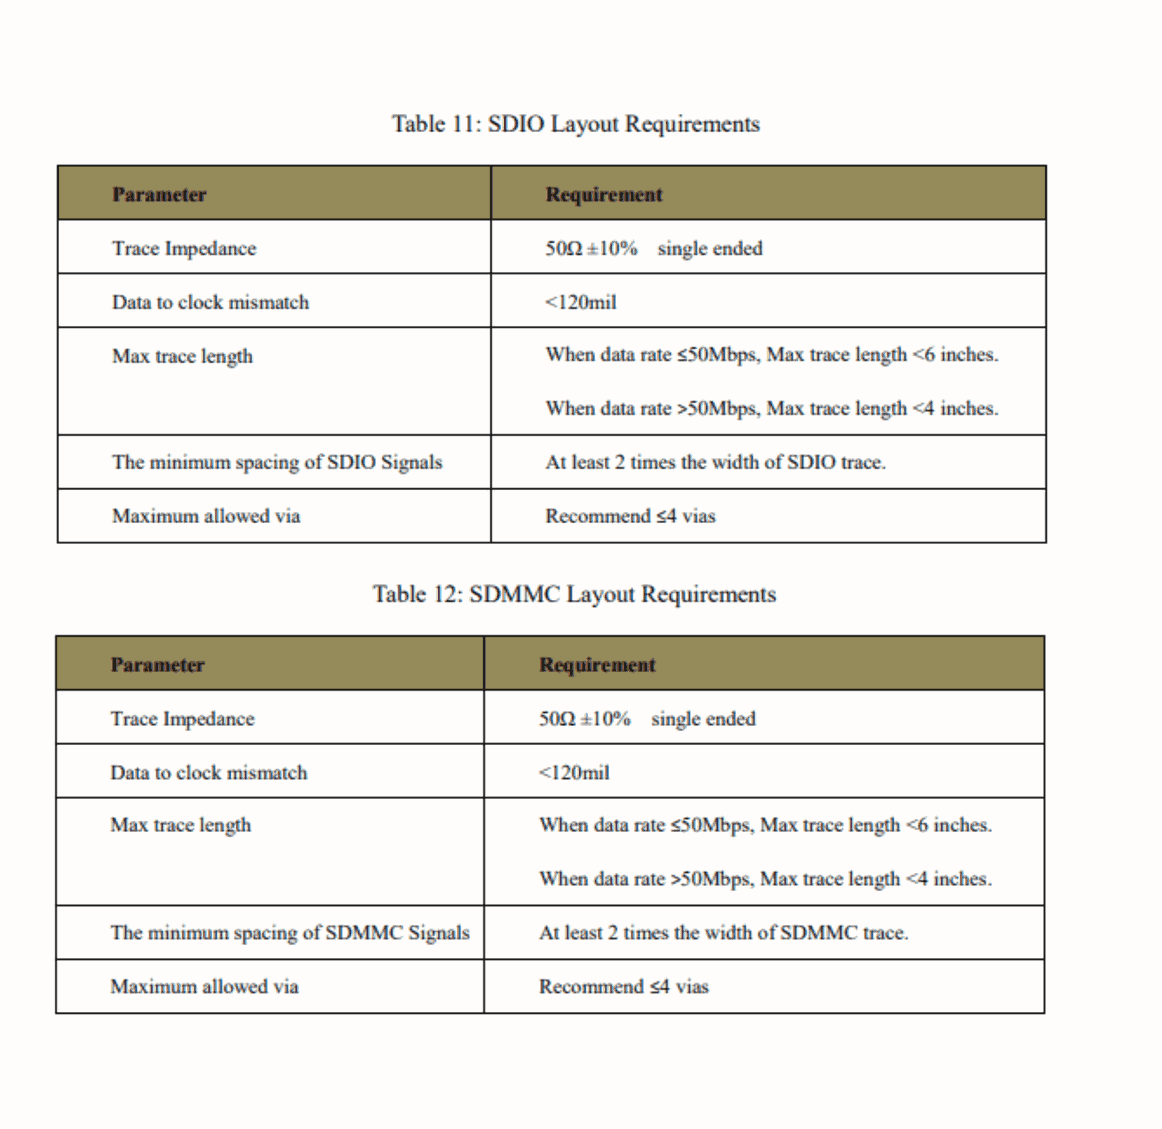
[diagram p13: RK3568-VI-Interface-Sheet.SchDoc, left]
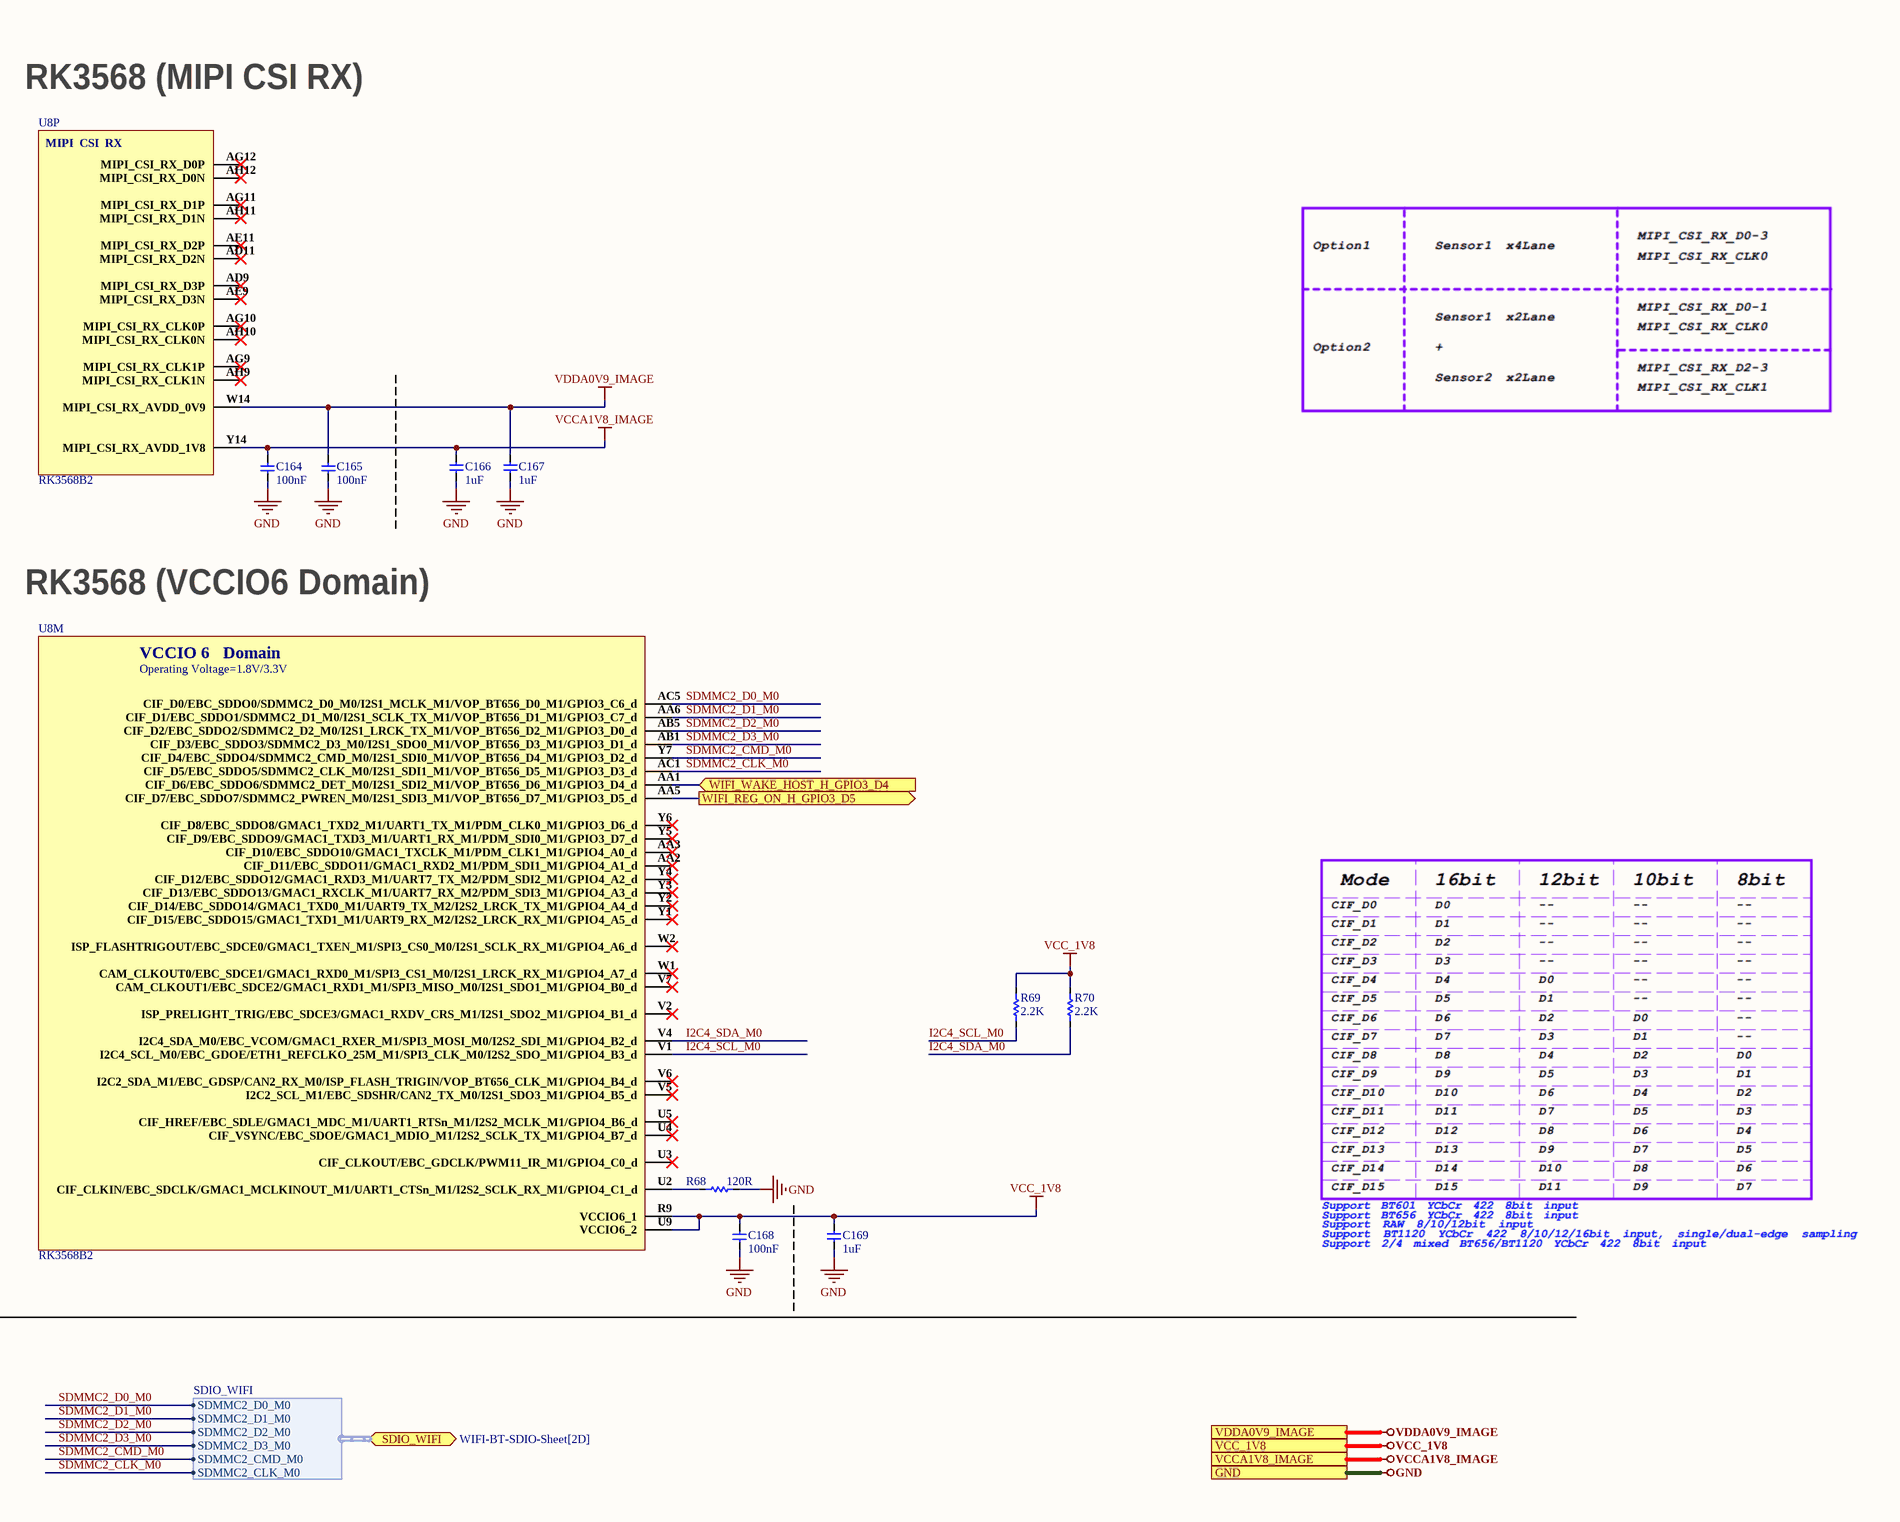
[diagram p14: RK3568-VI-Interface-Sheet.SchDoc, right]

### Parts
C164  100nF  [CAP-0201]
C165  100nF  [CAP-0201]
C166  1uF  [Cap-0402]
C167  1uF  [Cap-0402]
C168  100nF  [CAP-0201]
C169  1uF  [Cap-0402]
R68  120R  [Res-0201]
R69  2.2K  [Res-0402]
R70  2.2K  [Res-0402]
U8  RK3568B2  [FCCSP-636L]  (parts M,P of 23)

### Ports
GND (see Connector-Sheet[5D], DRAM-LPDDR4x-Sheet[4D], eMMC-Sheet[4D], LED-Debug-Sheet[4D], MicroSD-SPI-Flash-Sheet[4D], Power-DC-IN-Sheet[4D], Power-Others-Sheet[4D], Power-PMIC-Sheet[4D], RK3568-Audio-Interface[4D], RK3568-Flash-SD-Controller[4D], RK3568-OSC-PMUIO-Sheet[5D], RK3568-Power-Sheet[4D], RK3568-SARADC-GPIO[4D], RK3568-USB-PCIe-Sheet[5D], RK3568-VO-Interface-1[4D], RK3568-VO-Interface-2[4D], Sensors-Sheet-1[4D], Sensors-Sheet-2[5D], Type-C-Sheet[4D], USB-Ports[4D], VO-HDMI2.0-TX-Sheet[4D], VO-LCM-MIPI-DSI-TX0[4D], WIFI-BT-SDIO-Sheet[4D]), SDIO_WIFI (bidir, harness SDIO_WIFI, see WIFI-BT-SDIO-Sheet[2D]), VCC_1V8 (see Power-Others-Sheet[4D], Power-PMIC-Sheet[4D], RK3568-SARADC-GPIO[4D], WIFI-BT-SDIO-Sheet[4D]), VCCA1V8_IMAGE (see Power-PMIC-Sheet[4D], RK3568-VO-Interface-1[4D]), VDDA0V9_IMAGE (see Power-PMIC-Sheet[3D], RK3568-VO-Interface-1[4D]), WIFI_REG_ON_H_GPIO3_D5 (out, see WIFI-BT-SDIO-Sheet[2B]), WIFI_WAKE_HOST_H_GPIO3_D4 (in, see WIFI-BT-SDIO-Sheet[2B])

### Harnesses
SDIO_WIFI: SDMMC2_D0_M0, SDMMC2_D1_M0, SDMMC2_D2_M0, SDMMC2_D3_M0, SDMMC2_CMD_M0, SDMMC2_CLK_M0

### Nets
GND: C164.1 C165.1 C166.2 C167.2 C168.1 C169.2 R68.2 ; port GND
VCC_1V8: C168.2 C169.1 R69.2 R70.2 U8.R9(VCCIO6_1) U8.U9(VCCIO6_2) ; port VCC_1V8
VCCA1V8_IMAGE: C164.2 C166.1 U8.Y14(MIPI_CSI_RX_AVDD_1V8) ; port VCCA1V8_IMAGE
VDDA0V9_IMAGE: C165.2 C167.1 U8.W14(MIPI_CSI_RX_AVDD_0V9) ; port VDDA0V9_IMAGE
I2C4_SCL_M0: R69.1 U8.V1(I2C4_SCL_M0/EBC_GDOE/ETH1_REFCLKO_25M_M1/SPI3_CLK_M0/I2S2_SDO_M1/GPIO4_B3_d)
I2C4_SDA_M0: R70.1 U8.V4(I2C4_SDA_M0/EBC_VCOM/GMAC1_RXER_M1/SPI3_MOSI_M0/I2S2_SDI_M1/GPIO4_B2_d)
SDMMC2_CLK_M0: U8.AC1(CIF_D5/EBC_SDDO5/SDMMC2_CLK_M0/I2S1_SDI1_M1/VOP_BT656_D5_M1/GPIO3_D3_d) ; port SDIO_WIFI.SDMMC2_CLK_M0
SDMMC2_CMD_M0: U8.Y7(CIF_D4/EBC_SDDO4/SDMMC2_CMD_M0/I2S1_SDI0_M1/VOP_BT656_D4_M1/GPIO3_D2_d) ; port SDIO_WIFI.SDMMC2_CMD_M0
SDMMC2_D0_M0: U8.AC5(CIF_D0/EBC_SDDO0/SDMMC2_D0_M0/I2S1_MCLK_M1/VOP_BT656_D0_M1/GPIO3_C6_d) ; port SDIO_WIFI.SDMMC2_D0_M0
SDMMC2_D1_M0: U8.AA6(CIF_D1/EBC_SDDO1/SDMMC2_D1_M0/I2S1_SCLK_TX_M1/VOP_BT656_D1_M1/GPIO3_C7_d) ; port SDIO_WIFI.SDMMC2_D1_M0
SDMMC2_D2_M0: U8.AB5(CIF_D2/EBC_SDDO2/SDMMC2_D2_M0/I2S1_LRCK_TX_M1/VOP_BT656_D2_M1/GPIO3_D0_d) ; port SDIO_WIFI.SDMMC2_D2_M0
SDMMC2_D3_M0: U8.AB1(CIF_D3/EBC_SDDO3/SDMMC2_D3_M0/I2S1_SDO0_M1/VOP_BT656_D3_M1/GPIO3_D1_d) ; port SDIO_WIFI.SDMMC2_D3_M0
NetR68_1: R68.1 U8.U2(CIF_CLKIN/EBC_SDCLK/GMAC1_MCLKINOUT_M1/UART1_CTSn_M1/I2S2_SCLK_RX_M1/GPIO4_C1_d)
NetR153_1: U8.AA5(CIF_D7/EBC_SDDO7/SDMMC2_PWREN_M0/I2S1_SDI3_M1/VOP_BT656_D7_M1/GPIO3_D5_d) ; port WIFI_REG_ON_H_GPIO3_D5
NetU8_AA1: U8.AA1(CIF_D6/EBC_SDDO6/SDMMC2_DET_M0/I2S1_SDI2_M1/VOP_BT656_D6_M1/GPIO3_D4_d) ; port WIFI_WAKE_HOST_H_GPIO3_D4

Not connected (* = marked no-connect by the designer): U8 AA2(CIF_D11/EBC_SDDO11/GMAC1_RXD2_M1/PDM_SDI1_M1/GPIO4_A1_d)* AA3(CIF_D10/EBC_SDDO10/GMAC1_TXCLK_M1/PDM_CLK1_M1/GPIO4_A0_d)* AD9(MIPI_CSI_RX_D3P)* AD11(MIPI_CSI_RX_D2N)* AE9(MIPI_CSI_RX_D3N)* AE11(MIPI_CSI_RX_D2P)* AG9(MIPI_CSI_RX_CLK1P)* AG10(MIPI_CSI_RX_CLK0P)* AG11(MIPI_CSI_RX_D1P)* AG12(MIPI_CSI_RX_D0P)* AH9(MIPI_CSI_RX_CLK1N)* AH10(MIPI_CSI_RX_CLK0N)* AH11(MIPI_CSI_RX_D1N)* AH12(MIPI_CSI_RX_D0N)* U3(CIF_CLKOUT/EBC_GDCLK/PWM11_IR_M1/GPIO4_C0_d)* U4(CIF_VSYNC/EBC_SDOE/GMAC1_MDIO_M1/I2S2_SCLK_TX_M1/GPIO4_B7_d)* U5(CIF_HREF/EBC_SDLE/GMAC1_MDC_M1/UART1_RTSn_M1/I2S2_MCLK_M1/GPIO4_B6_d)* V2(ISP_PRELIGHT_TRIG/EBC_SDCE3/GMAC1_RXDV_CRS_M1/I2S1_SDO2_M1/GPIO4_B1_d)* V5(I2C2_SCL_M1/EBC_SDSHR/CAN2_TX_M0/I2S1_SDO3_M1/GPIO4_B5_d)* V6(I2C2_SDA_M1/EBC_GDSP/CAN2_RX_M0/ISP_FLASH_TRIGIN/VOP_BT656_CLK_M1/GPIO4_B4_d)* V7(CAM_CLKOUT1/EBC_SDCE2/GMAC1_RXD1_M1/SPI3_MISO_M0/I2S1_SDO1_M1/GPIO4_B0_d)* W1(CAM_CLKOUT0/EBC_SDCE1/GMAC1_RXD0_M1/SPI3_CS1_M0/I2S1_LRCK_RX_M1/GPIO4_A7_d)* W2(ISP_FLASHTRIGOUT/EBC_SDCE0/GMAC1_TXEN_M1/SPI3_CS0_M0/I2S1_SCLK_RX_M1/GPIO4_A6_d)* Y1(CIF_D15/EBC_SDDO15/GMAC1_TXD1_M1/UART9_RX_M2/I2S2_LRCK_RX_M1/GPIO4_A5_d)* Y2(CIF_D14/EBC_SDDO14/GMAC1_TXD0_M1/UART9_TX_M2/I2S2_LRCK_TX_M1/GPIO4_A4_d)* Y3(CIF_D13/EBC_SDDO13/GMAC1_RXCLK_M1/UART7_RX_M2/PDM_SDI3_M1/GPIO4_A3_d)* Y4(CIF_D12/EBC_SDDO12/GMAC1_RXD3_M1/UART7_TX_M2/PDM_SDI2_M1/GPIO4_A2_d)* Y5(CIF_D9/EBC_SDDO9/GMAC1_TXD3_M1/UART1_RX_M1/PDM_SDI0_M1/GPIO3_D7_d)* Y6(CIF_D8/EBC_SDDO8/GMAC1_TXD2_M1/UART1_TX_M1/PDM_CLK0_M1/GPIO3_D6_d)*

### Notes on the sheet
- RK3568 (MIPI CSI RX)
- RK3568 (VCCIO6 Domain)
- File:
- Title:
- Date:
- Page
- Num:
- Total:
- Drawn By: Huzaifa Ali
- (in symbol RK3568B2, part M) VCCIO 6   Domain; Operating Voltage=1.8V/3.3V
- (in symbol RK3568B2, part P) MIPI  CSI  RX

### Library data of the parts
C164 C165 C168 = CC0201KRX5R6BB104: as C124-C131 on sheet RK3568-OSC-PMUIO-Sheet; Supplier 1: Mouser; Manufacturer Part Number: CC0201KRX5R6BB104; RoHS: Yes; Category: Ceramic Capacitors; Stock 1: 824403; Pricing 1: 1=0.10000, 10=0.02400, 50=0.02400, 100=0.01900, 1000=0.01100, 10000=0.00900 (USD); Mount: Surface Mount; Case/Package: 0201; Case Code (Imperial): 0201; Case Code (Metric): 0603; Weight: 6E-06oz; Min Operating Temperature: -55°C; Max Operating Temperature: 85°C; Capacitance: 100nF; Dielectric: X5R; Voltage Rating (DC): 10V; Packaging: Tape and Reel; Termination: SMD/SMT; Resistor Type: Ceramic; Voltage Rating: 10V; Series: CC; Construction: Flat; Length: 0.6mm; Width: 0.012inch; Height: 0.3mm; Thickness: 0.013inch; Depth: 0.3mm; Radiation Hardening: No; Lead Free: Lead Free; Halogen Free: Halogen Free; RoHS Compliant: Yes; ComponentLink1URL: https://datasheet.ciiva.com/11587/upy-gphc-x5r-4v-to-50v-12-11587190.pdf?src-supplier=Avnet; ComponentLink1Description: https://datasheet.ciiva.com/11587/upy-gphc-x5r-4v-to-50v-12-11587190.pdf?src-supplier=Avnet; Supplier Part Number 1: 603-CC201KRX5R6BB104; LCSC Part Number: C190183
C166 C167 C169 = CC0402KRX5R6BB105: as C119-C122 on sheet RK3568-OSC-PMUIO-Sheet; Supplier 1: Mouser; Manufacturer Part Number: CC0402KRX5R6BB105; RoHS: Yes; Category: Ceramic Capacitors; Stock 1: 6711367; Pricing 1: 1=0.11000, 10=0.05500, 50=0.05500, 100=0.03300, 500=0.02700, 1000=0.02200, 2500=0.02100, 10000=0.01800 (USD); Mount: Surface Mount; Case/Package: 0402; Number of Pins: 2; Case Code (Metric): 1005; Case Code (Imperial): 0402; Min Operating Temperature: -55°C; Max Operating Temperature: 85°C; Capacitance: 1uF; Dielectric: X5R; Package Quantity: 1; Voltage Rating: 10V; Packaging: Tape and Reel; Voltage Rating (DC): 10V; Termination: SMD/SMT; Resistor Type: Ceramic; Series: CC; Construction: Flat; Length: 1mm; Width: 0.02inch; Height: 0.5mm; Thickness: 0.022inch; Depth: 0.5mm; Radiation Hardening: No; REACH SVHC: No SVHC; Lead Free: Lead Free; Halogen Free: Halogen Free; RoHS Compliant: Yes; ComponentLink1URL: https://datasheet.ciiva.com/176/upy-gphc-x5r-4v-to-50v-12-176704.pdf?src-supplier=Digi-Key; ComponentLink1Description: https://datasheet.ciiva.com/176/upy-gphc-x5r-4v-to-50v-12-176704.pdf?src-supplier=Digi-Key; ComponentLink2URL: https://datasheet.ciiva.com/176/mlccorderingcode-176705.pdf?src-supplier=Digi-Key; ComponentLink2Description: https://datasheet.ciiva.com/176/mlccorderingcode-176705.pdf?src-supplier=Digi-Key; ComponentLink3URL: https://datasheet.ciiva.com/176/mlccorderingcode-176706.pdf?src-supplier=Digi-Key; ComponentLink3Description: https://datasheet.ciiva.com/176/mlccorderingcode-176706.pdf?src-supplier=Digi-Key; Supplier Part Number 1: 603-CC402KRX5R6BB105; LCSC Part Number: C106254
R68 = RC0201FR-07120RL: as R58 on sheet RK3568-SARADC-GPIO; Supplier: Digikey; Supplier Part Number: 311-120MCT-ND; Manufacturer Part Number: RC0201FR-07120RL; RoHS: Yes; Category: Chip SMD Resistors; Stock: 38339; Pricing: 1=0.1, 10=0.027, 50=0.0172, 100=0.0143, 500=0.00988, 1000=0.00854, 5000=0.00629 (USD); Lead Free: 5697LeadFree; ComponentLink1URL: https://datasheet.ciiva.com/2525/pyu-r-int-thick-7-2525064.pdf?src-supplier=Digikey; ComponentLink1Description: https://datasheet.ciiva.com/2525/pyu-r-int-thick-7-2525064.pdf?src-supplier=Digikey; ComponentLink2URL: https://datasheet.ciiva.com/22661/1563626-22661285.pdf?src-supplier=Element14; ComponentLink2Description: https://datasheet.ciiva.com/22661/1563626-22661285.pdf?src-supplier=Element14; ComponentLink3URL: https://datasheet.ciiva.com/2525/pyu-r-int-thick-7-2525062.pdf?src-supplier=Digikey; ComponentLink3Description: https://datasheet.ciiva.com/2525/pyu-r-int-thick-7-2525062.pdf?src-supplier=Digikey; ComponentLink4URL: https://datasheet.ciiva.com/2525/pyu-r-int-thick-7-2525063.pdf?src-supplier=Digikey; ComponentLink4Description: https://datasheet.ciiva.com/2525/pyu-r-int-thick-7-2525063.pdf?src-supplier=Digikey; LCSC Part Number: C295718
R69 R70 = RC0402FR-072K2L: RES SMD 2.2K OHM 1% 1/16W 0402; Manufacturer: Yageo; Resistance: 2.2kR; Power Rating: 63mW; Voltage Rating: 50V; Temperature Coefficient: 100ppm/°C; Supplier 1: Digi-Key; Manufacturer Part Number: RC0402FR-072K2L; Stock 1: 966157; Pricing 1: 1=0.1, 10=0.016, 100=0.0066, 1000=0.00299, 2500=0.00259, 5000=0.00214 (USD); Case/Package: 0402; Case Code (Imperial): 0402; Case Code (Metric): 1005; Weight: 2.3E-05oz; Size Code: 0402; Min Operating Temperature: -55°C; Max Operating Temperature: 155°C; Resistor Type: Thick Film; Packaging: Tape and Reel; Tolerance: 1%; Termination: SMD/SMT; Features: Moisture Resistant; Series: RC; Max Power Dissipation: 63mW; Number of Terminations: 2; Resistance Tolerance: 1%; Construction: Rectangular; Technology: THICK FILM; Length: 1mm; Width: 0.5mm; Height: 0.35mm; Depth: 0.5mm; RoHS Compliant: Yes; REACH SVHC: Unknown; Military Standard: Not; Lead Free: Lead Free; ComponentLink1URL: http://www.farnell.com/datasheets/2167052.pdf?src-supplier=Element14; ComponentLink1Description: http://www.farnell.com/datasheets/2167052.pdf?src-supplier=Element14; ComponentLink2URL: http://www.yageo.com/documents/recent/PYu-RC_Group_51_RoHS_L_9.pdf?src-supplier=Mouser; ComponentLink2Description: http://www.yageo.com/documents/recent/PYu-RC_Group_51_RoHS_L_9.pdf?src-supplier=Mouser; ComponentLink3URL: http://documents.rs-components.com/techlib://itc_doclist_GB.htm?stockno=6186532&src-supplier=RSComponents; ComponentLink3Description: http://documents.rs-components.com/techlib://itc_doclist_GB.htm?stockno=6186532&src-supplier=RSComponents; ComponentLink4URL: http://www.yageo.com/documents/recent/PYu-RC0402_51_RoHS_L_6_r.pdf?src-supplier=Future+Electronics; ComponentLink4Description: http://www.yageo.com/documents/recent/PYu-RC0402_51_RoHS_L_6_r.pdf?src-supplier=Future+Electronics; Supplier Part Number 1: 311-2.20KLRCT-ND; LCSC Part Number: C114762
U8 = RK3568B2: as U8 on sheet RK3568-Flash-SD-Controller; Manufacturer Part Number: RK3568B2; Package: FCCSP-636L; LCSC Part Number: C3345225